# EAGLE design ce_hdd_scsi (EAGLE 6.2)
Assembly variants: ACSI, SCSI

## Sheet 1 of 4: IKBD part
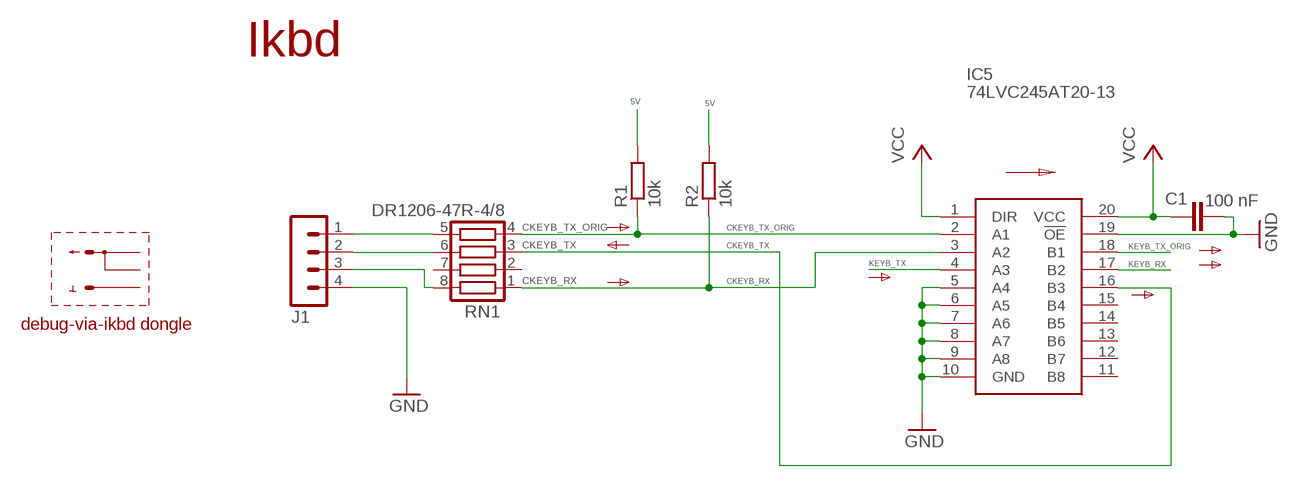
[diagram p0: schematic, sheet 1]

### Parts
C1  100 nF  C-EUC0603  [C0603]
IC5  74LVC245AT20-13  [SOP65P640X120-20N]
J1  MA04-1  [MA04-1]
R1  10k  R-EU_R0603  [R0603]
R2  10k  R-EU_R0603  [R0603]
RN1  DR1206-47R-4/8  CTS742C083  [CTS742C083]

### Nets
5V: R1.2 R2.2 ; also sheet 3,4
CKEYB_RX: IC5.3(A2) R2.1 RN1.1
CKEYB_TX: IC5.16(B3) RN1.3
CKEYB_TX_ORIG: IC5.2(A1) R1.1 RN1.4
GND: C1.1 IC5.5(A4) IC5.6(A5) IC5.7(A6) IC5.8(A7) IC5.9(A8) IC5.10(GND) IC5.19(!OE) J1.4 ; also sheet 2,3,4
KEYB_RX: IC5.17(B2) ; also sheet 4
KEYB_TX: IC5.4(A3) ; also sheet 4
KEYB_TX_ORIG: IC5.18(B1) ; also sheet 4
N$21: J1.2 RN1.6
VCC: C1.2 IC5.1(DIR) IC5.20(VCC) ; also sheet 2,4
ZKEYB_RX: J1.3 RN1.8
ZKEYB_TX_ORIG: J1.1 RN1.5
Unconnected: IC5.11(B8) IC5.12(B7) IC5.13(B6) IC5.14(B5) IC5.15(B4) RN1.2 RN1.7

### Notes on the sheet
- Ikbd
- debug-via-ikbd dongle

## Sheet 2 of 4: SCSI drivers and termination
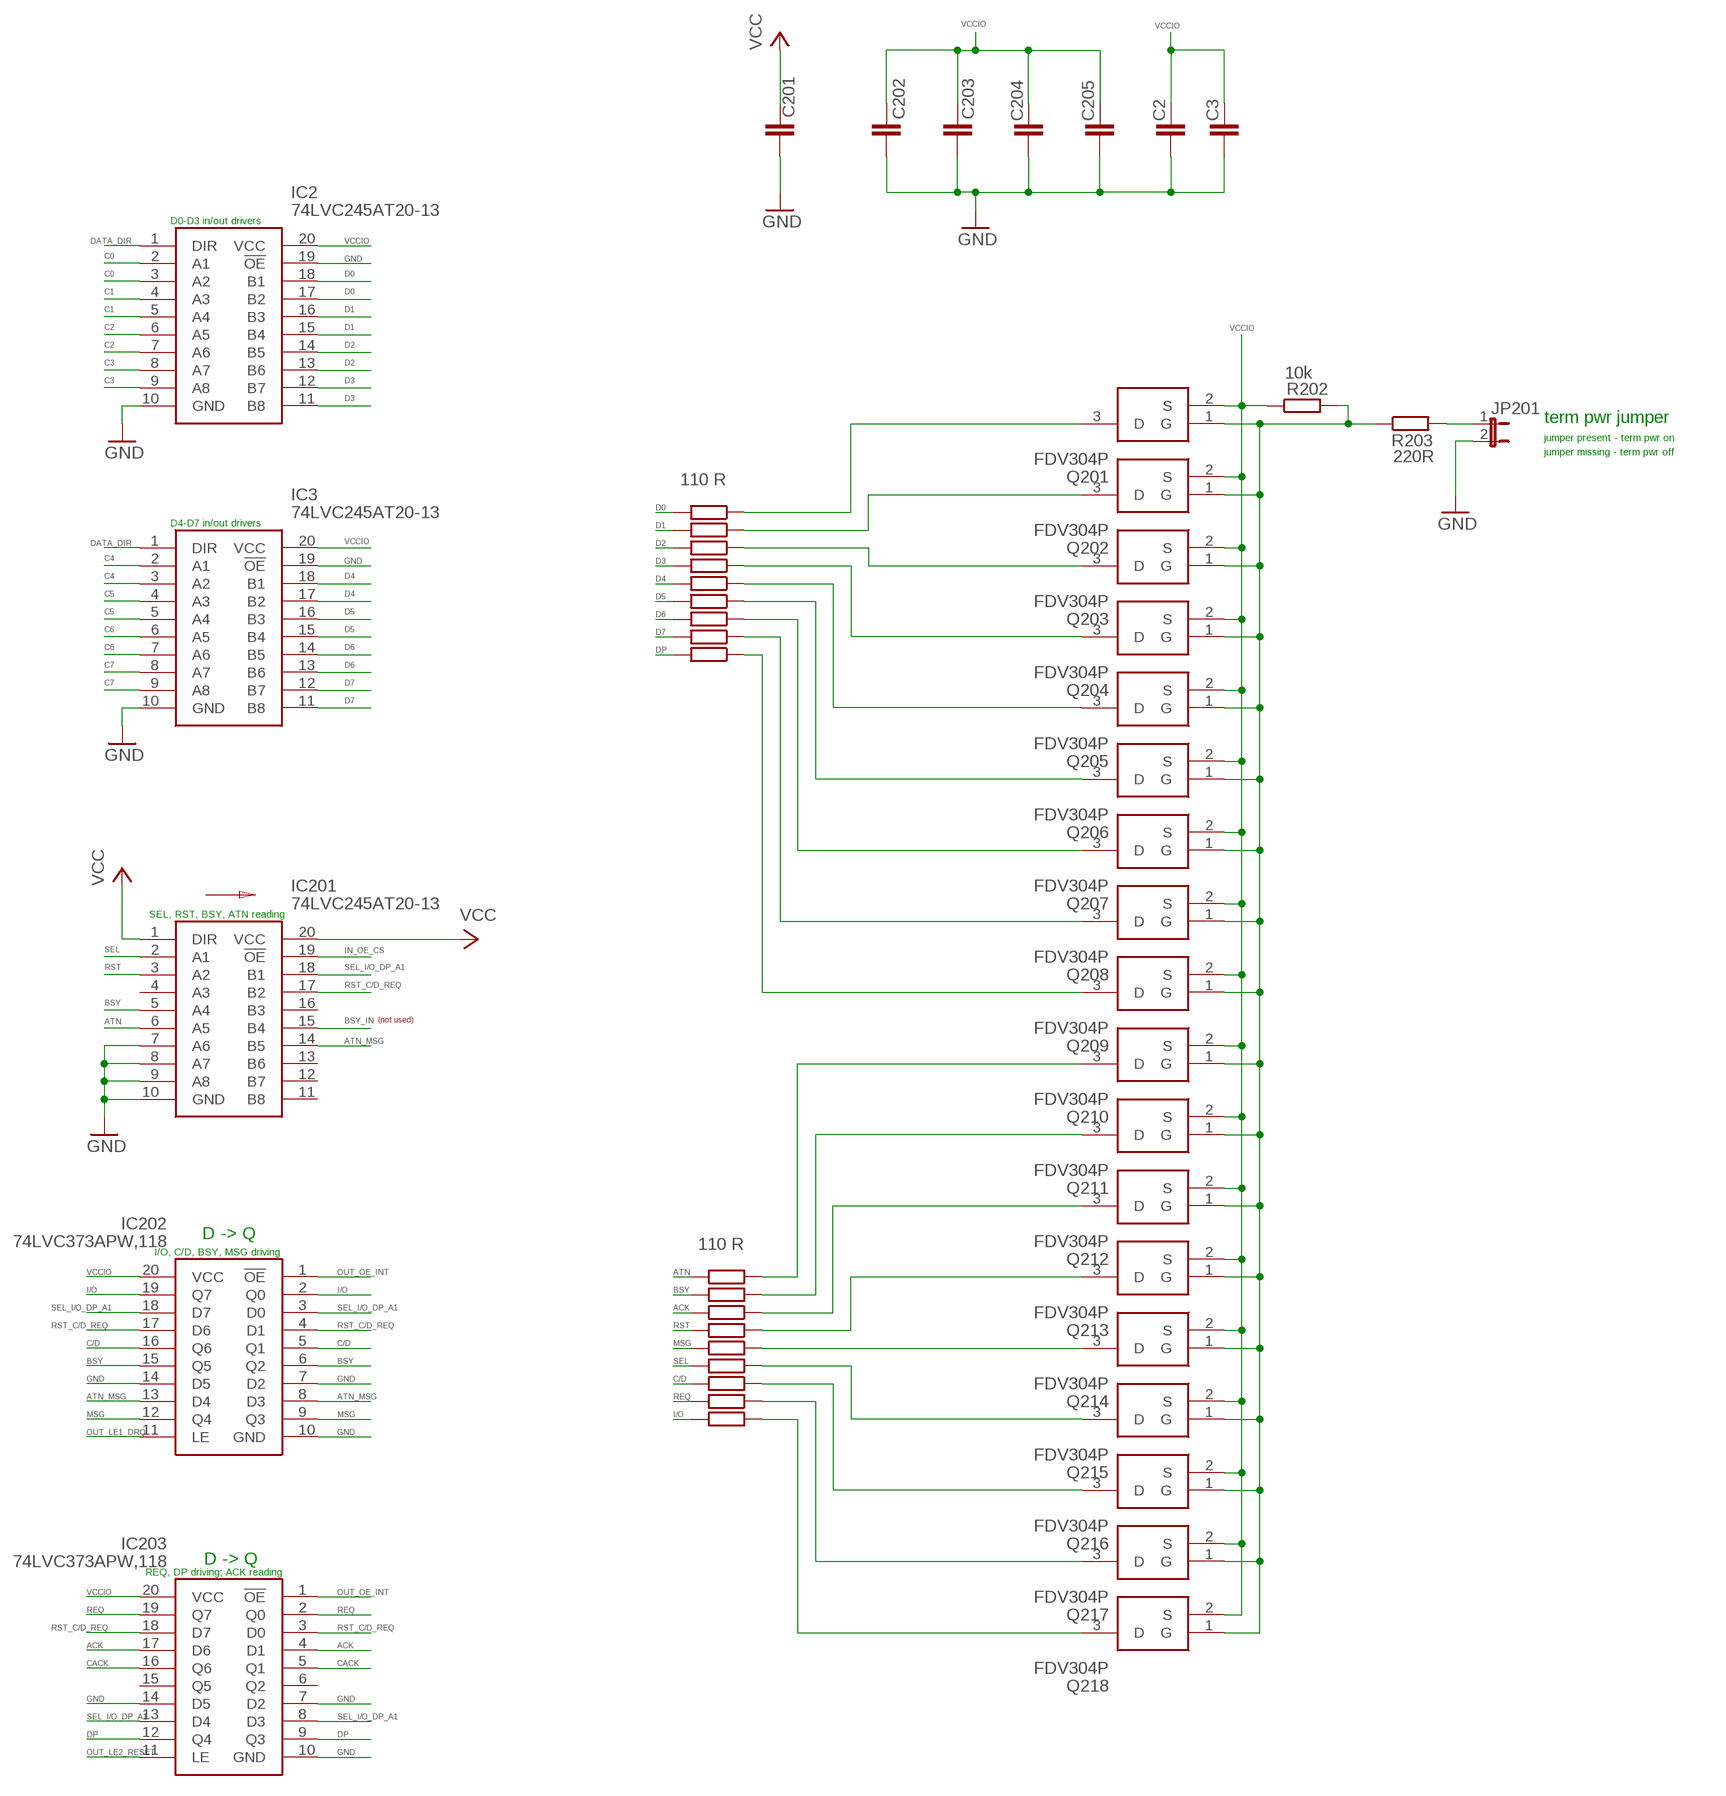
[diagram p1: schematic, sheet 2]

### Parts
C2  100 nF  C-EUC0603  [C0603]
C3  100 nF  C-EUC0603  [C0603]
C201  100 nF  C-EUC0603  [C0603]  (not fitted in variant ACSI)
C202  100 nF  C-EUC0603  [C0603]  (not fitted in variant ACSI)
C203  1 uF  C-EUC0603  [C0603]  (not fitted in variant ACSI)
C204  100 nF  C-EUC0603  [C0603]  (not fitted in variant ACSI)
C205  100 nF  C-EUC0603  [C0603]  (not fitted in variant ACSI)
IC2  74LVC245AT20-13  [SOP65P640X120-20N]
IC3  74LVC245AT20-13  [SOP65P640X120-20N]
IC201  74LVC245AT20-13  [SOP65P640X120-20N]  (not fitted in variant ACSI)
IC202  74LVC373APW,118  [SOP65P640X110-20N]  (not fitted in variant ACSI)
IC203  74LVC373APW,118  [SOP65P640X110-20N]  (not fitted in variant ACSI)
JP201  JP1E  [JP1]  (not fitted in variant ACSI)
Q201  FDV304P  IRLML6401TRPBF  [SOT95P237X112-3N]  (not fitted in variant ACSI)
Q202  FDV304P  IRLML6401TRPBF  [SOT95P237X112-3N]  (not fitted in variant ACSI)
Q203  FDV304P  IRLML6401TRPBF  [SOT95P237X112-3N]  (not fitted in variant ACSI)
Q204  FDV304P  IRLML6401TRPBF  [SOT95P237X112-3N]  (not fitted in variant ACSI)
Q205  FDV304P  IRLML6401TRPBF  [SOT95P237X112-3N]  (not fitted in variant ACSI)
Q206  FDV304P  IRLML6401TRPBF  [SOT95P237X112-3N]  (not fitted in variant ACSI)
Q207  FDV304P  IRLML6401TRPBF  [SOT95P237X112-3N]  (not fitted in variant ACSI)
Q208  FDV304P  IRLML6401TRPBF  [SOT95P237X112-3N]  (not fitted in variant ACSI)
Q209  FDV304P  IRLML6401TRPBF  [SOT95P237X112-3N]  (not fitted in variant ACSI)
Q210  FDV304P  IRLML6401TRPBF  [SOT95P237X112-3N]  (not fitted in variant ACSI)
Q211  FDV304P  IRLML6401TRPBF  [SOT95P237X112-3N]  (not fitted in variant ACSI)
Q212  FDV304P  IRLML6401TRPBF  [SOT95P237X112-3N]  (not fitted in variant ACSI)
Q213  FDV304P  IRLML6401TRPBF  [SOT95P237X112-3N]  (not fitted in variant ACSI)
Q214  FDV304P  IRLML6401TRPBF  [SOT95P237X112-3N]  (not fitted in variant ACSI)
Q215  FDV304P  IRLML6401TRPBF  [SOT95P237X112-3N]  (not fitted in variant ACSI)
Q216  FDV304P  IRLML6401TRPBF  [SOT95P237X112-3N]  (not fitted in variant ACSI)
Q217  FDV304P  IRLML6401TRPBF  [SOT95P237X112-3N]  (not fitted in variant ACSI)
Q218  FDV304P  IRLML6401TRPBF  [SOT95P237X112-3N]  (not fitted in variant ACSI)
R202  10k  R-EU_R0603  [R0603]  (not fitted in variant ACSI)
R203  220R  R-EU_R0603  [R0603]  (not fitted in variant ACSI)
R204  110 R  R-EU_R0603  [R0603]  (not fitted in variant ACSI)
R205  110 R  R-EU_R0603  [R0603]  (not fitted in variant ACSI)
R206  110 R  R-EU_R0603  [R0603]  (not fitted in variant ACSI)
R207  110 R  R-EU_R0603  [R0603]  (not fitted in variant ACSI)
R208  110 R  R-EU_R0603  [R0603]  (not fitted in variant ACSI)
R209  110 R  R-EU_R0603  [R0603]  (not fitted in variant ACSI)
R210  110 R  R-EU_R0603  [R0603]  (not fitted in variant ACSI)
R211  110 R  R-EU_R0603  [R0603]  (not fitted in variant ACSI)
R212  110 R  R-EU_R0603  [R0603]  (not fitted in variant ACSI)
R213  110 R  R-EU_R0603  [R0603]  (not fitted in variant ACSI)
R214  110 R  R-EU_R0603  [R0603]  (not fitted in variant ACSI)
R215  110 R  R-EU_R0603  [R0603]  (not fitted in variant ACSI)
R216  110 R  R-EU_R0603  [R0603]  (not fitted in variant ACSI)
R217  110 R  R-EU_R0603  [R0603]  (not fitted in variant ACSI)
R218  110 R  R-EU_R0603  [R0603]  (not fitted in variant ACSI)
R219  110 R  R-EU_R0603  [R0603]  (not fitted in variant ACSI)
R220  110 R  R-EU_R0603  [R0603]  (not fitted in variant ACSI)
R221  110 R  R-EU_R0603  [R0603]  (not fitted in variant ACSI)

### Nets
AAAA: Q201.3(D) R204.1
ACK: IC203.4(D1) IC203.17(D6) R215.2 ; also sheet 3
ATN: IC201.6(A5) R213.2 ; also sheet 3
ATN_MSG: IC201.14(B5) IC202.8(D3) IC202.13(D4) ; also sheet 4
BSY: IC201.5(A4) IC202.6(Q2) IC202.15(Q5) R214.2 ; also sheet 3
BSY_IN: IC201.15(B4)
C0: IC2.2(A1) IC2.3(A2) ; also sheet 4
C1: IC2.4(A3) IC2.5(A4) ; also sheet 4
C2: IC2.6(A5) IC2.7(A6) ; also sheet 4
C3: IC2.8(A7) IC2.9(A8) ; also sheet 4
C4: IC3.2(A1) IC3.3(A2) ; also sheet 4
C5: IC3.4(A3) IC3.5(A4) ; also sheet 4
C6: IC3.6(A5) IC3.7(A6) ; also sheet 4
C7: IC3.8(A7) IC3.9(A8) ; also sheet 4
C/D: IC202.5(Q1) IC202.16(Q6) R219.2 ; also sheet 3
CACK: IC203.5(Q1) IC203.16(Q6) ; also sheet 4
D0: IC2.17(B2) IC2.18(B1) R204.2 ; also sheet 3
D1: IC2.15(B4) IC2.16(B3) R205.2 ; also sheet 3
D2: IC2.13(B6) IC2.14(B5) R206.2 ; also sheet 3
D3: IC2.11(B8) IC2.12(B7) R207.2 ; also sheet 3
D4: IC3.17(B2) IC3.18(B1) R208.2 ; also sheet 3
D5: IC3.15(B4) IC3.16(B3) R209.2 ; also sheet 3
D6: IC3.13(B6) IC3.14(B5) R210.2 ; also sheet 3
D7: IC3.11(B8) IC3.12(B7) R211.2 ; also sheet 3
DATA_DIR: IC2.1(DIR) IC3.1(DIR) ; also sheet 4
DP: IC203.9(Q3) IC203.12(Q4) R212.2 ; also sheet 3
GND: C2.2 C3.2 C201.2 C202.2 C203.2 C204.2 C205.2 IC2.10(GND) IC2.19(!OE) IC3.10(GND) IC3.19(!OE) IC201.7(A6) IC201.8(A7) IC201.9(A8) IC201.10(GND) IC202.7(D2) IC202.10(GND) IC202.14(D5) IC203.7(D2) IC203.10(GND) IC203.14(D5) JP201.2 ; also sheet 1,3,4
I/O: IC202.2(Q0) IC202.19(Q7) R221.2 ; also sheet 3
IN_OE_CS: IC201.19(!OE) ; also sheet 4
MSG: IC202.9(Q3) IC202.12(Q4) R217.2 ; also sheet 3
N$8: JP201.1 R203.2
N$12: Q202.3(D) R205.1
N$13: Q203.3(D) R206.1
N$14: Q204.3(D) R207.1
N$15: Q205.3(D) R208.1
N$18: Q206.3(D) R209.1
N$19: Q207.3(D) R210.1
N$20: Q208.3(D) R211.1
N$22: Q209.3(D) R212.1
N$24: Q210.3(D) R213.1
N$100: Q211.3(D) R214.1
N$101: Q212.3(D) R215.1
N$102: Q213.3(D) R216.1
N$103: Q214.3(D) R217.1
N$104: Q215.3(D) R218.1
N$105: Q216.3(D) R219.1
N$106: Q217.3(D) R220.1
N$107: Q218.3(D) R221.1
OUT_LE1_DRQ: IC202.11(LE) ; also sheet 4
OUT_LE2_RESET: IC203.11(LE) ; also sheet 4
OUT_OE_INT: IC202.1(!OE) IC203.1(!OE) ; also sheet 4
REQ: IC203.2(Q0) IC203.19(Q7) R220.2 ; also sheet 3
RST: IC201.3(A2) R216.2 ; also sheet 3
RST_C/D_REQ: IC201.17(B2) IC202.4(D1) IC202.17(D6) IC203.3(D0) IC203.18(D7) ; also sheet 4
SEL: IC201.2(A1) R218.2 ; also sheet 3
SEL_I/O_DP_A1: IC201.18(B1) IC202.3(D0) IC202.18(D7) IC203.8(D3) IC203.13(D4) ; also sheet 4
TP_ON: Q201.1(G) Q202.1(G) Q203.1(G) Q204.1(G) Q205.1(G) Q206.1(G) Q207.1(G) Q208.1(G) Q209.1(G) Q210.1(G) Q211.1(G) Q212.1(G) Q213.1(G) Q214.1(G) Q215.1(G) Q216.1(G) Q217.1(G) Q218.1(G) R202.2 R203.1
VCC: C201.1 IC201.1(DIR) IC201.20(VCC) ; also sheet 1,4
VCCIO: C2.1 C3.1 C202.1 C203.1 C204.1 C205.1 IC2.20(VCC) IC3.20(VCC) IC202.20(VCC) IC203.20(VCC) Q201.2(S) Q202.2(S) Q203.2(S) Q204.2(S) Q205.2(S) Q206.2(S) Q207.2(S) Q208.2(S) Q209.2(S) Q210.2(S) Q211.2(S) Q212.2(S) Q213.2(S) Q214.2(S) Q215.2(S) Q216.2(S) Q217.2(S) Q218.2(S) R202.1 ; also sheet 3
Unconnected: IC201.4(A3) IC201.11(B8) IC201.12(B7) IC201.13(B6) IC201.16(B3) IC203.6(Q2) IC203.15(Q5)

### Notes on the sheet
- D0-D3 in/out drivers
- term pwr jumper
- jumper present - term pwr on
- jumper missing - term pwr off
- D4-D7 in/out drivers
- SEL, RST, BSY, ATN reading
- (not used)
- D -> Q
- I/O, C/D, BSY, MSG driving
- D -> Q
- REQ, DP driving; ACK reading

## Sheet 3 of 4: SCSI connectors
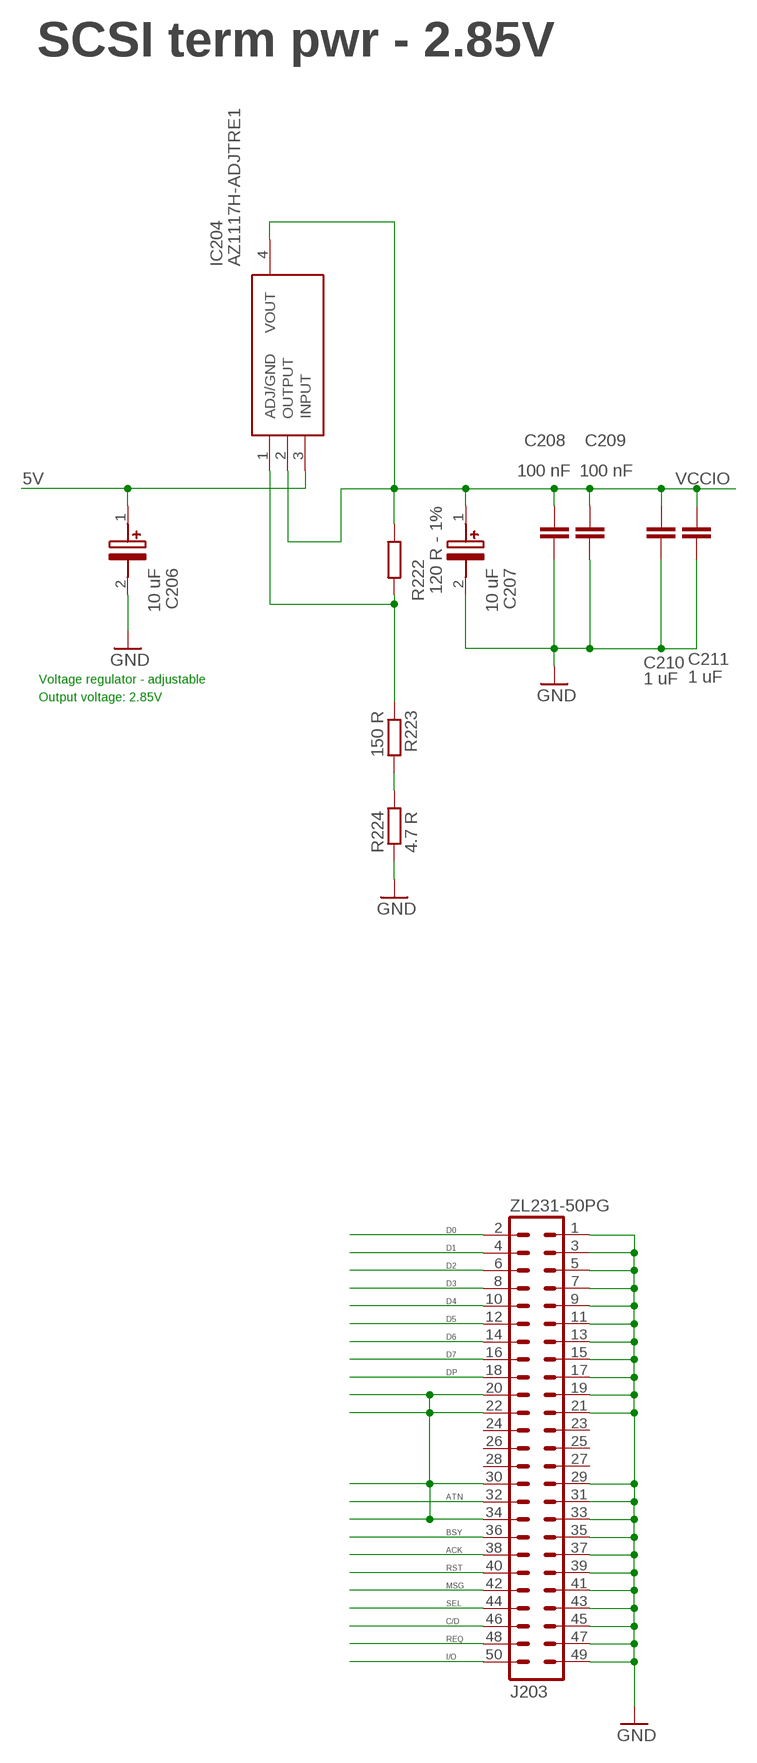
[diagram p2: schematic, sheet 3]

### Parts
C206  10 uF  293D106X9016B2TE3  [CAPPM3528X210N]  (not fitted in variant ACSI)
C207  10 uF  293D106X9016B2TE3  [CAPPM3528X210N]  (not fitted in variant ACSI)
C208  100 nF  C-EUC0603  [C0603]  (not fitted in variant ACSI)
C209  100 nF  C-EUC0603  [C0603]  (not fitted in variant ACSI)
C210  1 uF  C-EUC0603  [C0603]  (not fitted in variant ACSI)
C211  1 uF  C-EUC0603  [C0603]  (not fitted in variant ACSI)
IC204  AZ1117H-ADJTRE1  [SOT230P700X185-4N]  (not fitted in variant ACSI)
J203  ZL231-50PG  ML50  [ML50]  (not fitted in variant ACSI)
R222  120 R - 1%  R-EU_R0603  [R0603]  (not fitted in variant ACSI)
R223  150 R  R-EU_R0603  [R0603]  (not fitted in variant ACSI)
R224  4.7 R  R-EU_R0603  [R0603]  (not fitted in variant ACSI)

### Nets
5V: C206.1(+) IC204.3(INPUT) ; also sheet 1,4
ACK: J203.38 ; also sheet 2
ATN: J203.32 ; also sheet 2
BSY: J203.36 ; also sheet 2
C/D: J203.46 ; also sheet 2
D0: J203.2 ; also sheet 2
D1: J203.4 ; also sheet 2
D2: J203.6 ; also sheet 2
D3: J203.8 ; also sheet 2
D4: J203.10 ; also sheet 2
D5: J203.12 ; also sheet 2
D6: J203.14 ; also sheet 2
D7: J203.16 ; also sheet 2
DP: J203.18 ; also sheet 2
GND: C206.2(-) C207.2(-) C208.2 C209.2 C210.2 C211.2 J203.1 J203.3 J203.5 J203.7 J203.9 J203.11 J203.13 J203.15 J203.17 J203.19 J203.20 J203.21 J203.22 J203.29 J203.30 J203.31 J203.33 J203.34 J203.35 J203.37 J203.39 J203.41 J203.43 J203.45 J203.47 J203.49 R224.1 ; also sheet 1,2,4
I/O: J203.50 ; also sheet 2
MSG: J203.42 ; also sheet 2
N$5: R223.2 R224.2
N$30: IC204.1(ADJ/GND) R222.2 R223.1
REQ: J203.48 ; also sheet 2
RST: J203.40 ; also sheet 2
SEL: J203.44 ; also sheet 2
VCCIO: C207.1(+) C208.1 C209.1 C210.1 C211.1 IC204.2(OUTPUT) IC204.4(VOUT) R222.1 ; also sheet 2
Unconnected: J203.23 J203.24 J203.25 J203.26 J203.27 J203.28

### Notes on the sheet
- SCSI term pwr - 2.85V
- Voltage regulator - adjustable
- Output voltage: 2.85V

## Sheet 4 of 4: PICO, power, LEDs
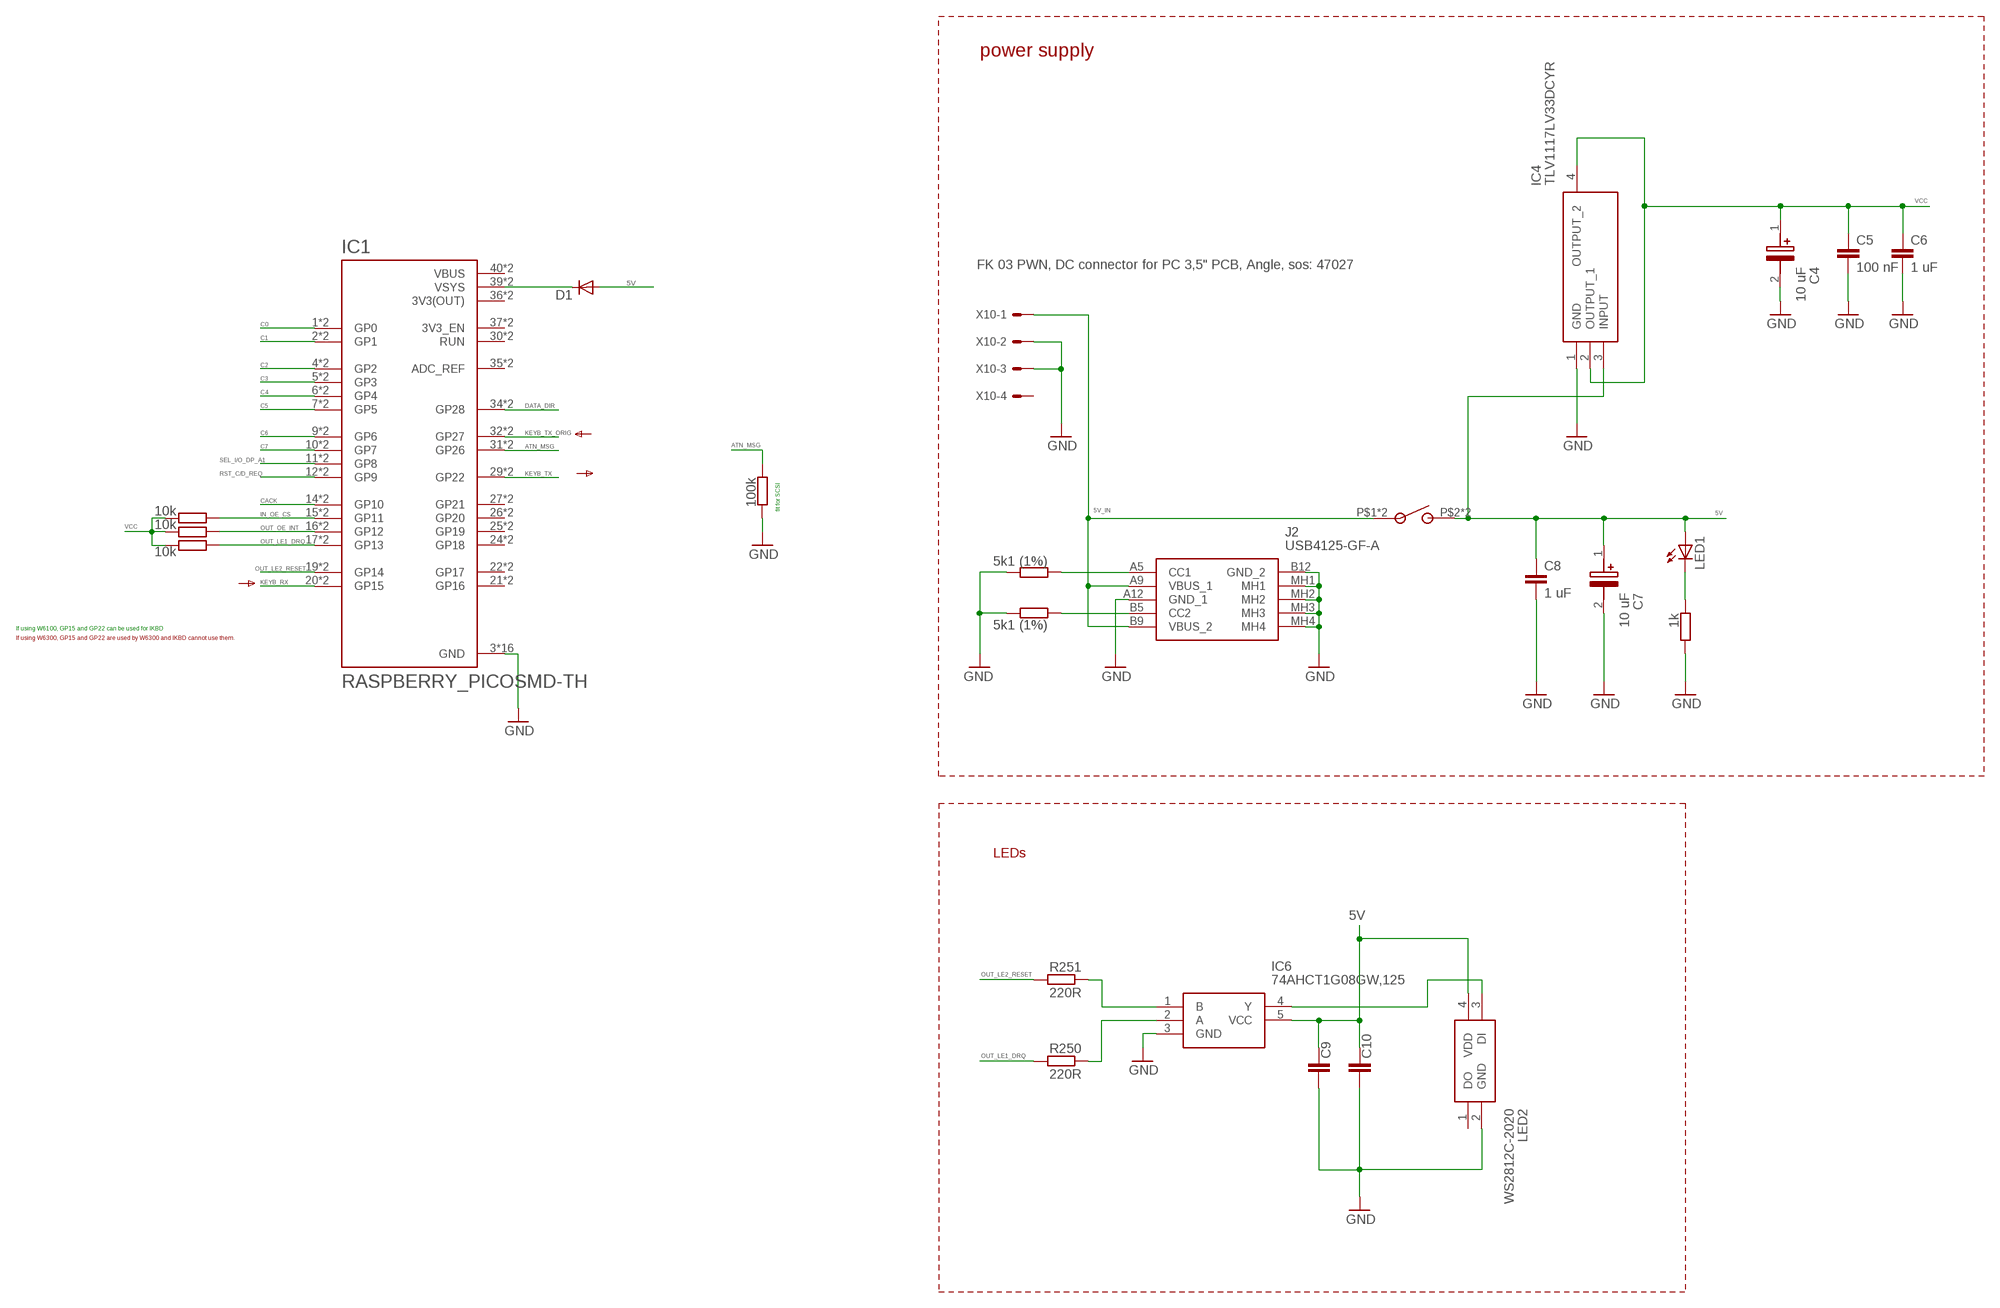
[diagram p3: schematic, sheet 4]

### Parts
C4  10 uF  293D106X9016B2TE3  [CAPPM3528X210N]
C5  100 nF  C-EUC0603  [C0603]
C6  1 uF  C-EUC0603  [C0603]
C7  10 uF  293D106X9016B2TE3  [CAPPM3528X210N]
C8  1 uF  C-EUC0603  [C0603]
C9  100 nF  C-EUC0603  [C0603]
C10  100 nF  C-EUC0603  [C0603]
D1  SK110-DIO  DIODE-DO214AC  [DO214AC]
IC1  RASPBERRY_PICOSMD-TH  [PICO-PKG]
IC4  TLV1117LV33DCYR  [SOT230P700X180-4N]
IC6  74AHCT1G08GW,125  [SOT65P212X110-5N]
J2  USB4125-GF-A  [USB4125GFA]
LED1  LEDSML0603  [SML0603]
LED2  WS2812C-2020  [WS2812C2020]
R3  5k1 (1%)  R-EU_R0603  [R0603]
R4  5k1 (1%)  R-EU_R0603  [R0603]
R5  1k  R-EU_R0603  [R0603]
R6  10k  R-EU_R0603  [R0603]
R7  10k  R-EU_R0603  [R0603]
R8  10k  R-EU_R0603  [R0603]
R225  100k  R-EU_R0603  [R0603]  (not fitted in variant ACSI)
R250  220R  R-EU_R0603  [R0603]  (not fitted in variant ACSI)
R251  220R  R-EU_R0603  [R0603]  (not fitted in variant ACSI)
SW1  SMSR-1  [SMRS-1]
X10  FK 03 PWN, DC connector for PC 3,5" PCB, Angle, sos: 47027  22-05-7048-04  [7395-04]

### Nets
5V: C7.1(+) C8.1 C9.1 C10.1 D1.A IC4.3(INPUT) IC6.5(VCC) LED1.A LED2.4(VDD) SW1.P$2 SW1.P$3 ; also sheet 1,3
5V_IN: J2.A9(VBUS_1) J2.B9(VBUS_2) SW1.P$1 SW1.P$4 X10.1
ATN_MSG: IC1.31(GP26) IC1.P$31(GP26) R225.1 ; also sheet 2
C0: IC1.1(GP0) IC1.P$1(GP0) ; also sheet 2
C1: IC1.2(GP1) IC1.P$2(GP1) ; also sheet 2
C2: IC1.4(GP2) IC1.P$4(GP2) ; also sheet 2
C3: IC1.5(GP3) IC1.P$5(GP3) ; also sheet 2
C4: IC1.6(GP4) IC1.P$6(GP4) ; also sheet 2
C5: IC1.7(GP5) IC1.P$7(GP5) ; also sheet 2
C6: IC1.9(GP6) IC1.P$9(GP6) ; also sheet 2
C7: IC1.10(GP7) IC1.P$10(GP7) ; also sheet 2
CACK: IC1.14(GP10) IC1.P$14(GP10) ; also sheet 2
DATA_DIR: IC1.34(GP28) IC1.P$34(GP28) ; also sheet 2
GND: C4.2(-) C5.2 C6.2 C7.2(-) C8.2 C9.2 C10.2 IC1.3(GND) IC1.8(GND) IC1.13(GND) IC1.18(GND) IC1.23(GND) IC1.28(GND) IC1.33(GND) IC1.38(GND) IC1.P$3(GND) IC1.P$8(GND) IC1.P$13(GND) IC1.P$18(GND) IC1.P$23(GND) IC1.P$28(GND) IC1.P$33(GND) IC1.P$38(GND) IC4.1(GND) IC6.3(GND) J2.A12(GND_1) J2.B12(GND_2) J2.MH1 J2.MH2 J2.MH3 J2.MH4 LED2.2(GND) R3.2 R4.2 R5.2 R225.2 X10.2 X10.3 ; also sheet 1,2,3
IN_OE_CS: IC1.15(GP11) IC1.P$15(GP11) R6.2 ; also sheet 2
KEYB_RX: IC1.20(GP15) IC1.P$20(GP15) ; also sheet 1
KEYB_TX: IC1.29(GP22) IC1.P$29(GP22) ; also sheet 1
KEYB_TX_ORIG: IC1.32(GP27) IC1.P$32(GP27) ; also sheet 1
N$1: J2.B5(CC2) R4.1
N$2: J2.A5(CC1) R3.1
N$3: IC6.2(A) R250.1
N$4: IC6.1(B) R251.1
N$6: LED1.C R5.1
N$7: IC6.4(Y) LED2.3(DI)
N$26: D1.C IC1.39(VSYS) IC1.P$39(VSYS)
OUT_LE1_DRQ: IC1.17(GP13) IC1.P$17(GP13) R8.2 R250.2 ; also sheet 2
OUT_LE2_RESET: IC1.19(GP14) IC1.P$19(GP14) R251.2 ; also sheet 2
OUT_OE_INT: IC1.16(GP12) IC1.P$16(GP12) R7.2 ; also sheet 2
RST_C/D_REQ: IC1.12(GP9) IC1.P$12(GP9) ; also sheet 2
SEL_I/O_DP_A1: IC1.11(GP8) IC1.P$11(GP8) ; also sheet 2
VCC: C4.1(+) C5.1 C6.1 IC4.2(OUTPUT_1) IC4.4(OUTPUT_2) R6.1 R7.1 R8.1 ; also sheet 1,2
Unconnected: IC1.21(GP16) IC1.22(GP17) IC1.24(GP18) IC1.25(GP19) IC1.26(GP20) IC1.27(GP21) IC1.30(RUN) IC1.35(ADC_REF) IC1.37(3V3_EN) IC1.P$21(GP16) IC1.P$22(GP17) IC1.P$24(GP18) IC1.P$25(GP19) IC1.P$26(GP20) IC1.P$27(GP21) IC1.P$30(RUN) IC1.P$35(ADC_REF) IC1.P$37(3V3_EN) LED2.1(DO) X10.4

### Notes on the sheet
- power supply
- fit for SCSI
- If using W6100, GP15 and GP22 can be used for IKBD
- If using W6300, GP15 and GP22 are used by W6300 and IKBD cannot use them.
- LEDs

## Power pins joined to a net without a drawn wire
3V3(OUT): IC1.36(3V3(OUT)) IC1.P$36(3V3(OUT))
VBUS: IC1.40(VBUS) IC1.P$40(VBUS)

## Library data of the parts
C1-C3 C5 C6 C8-C10 C201-C205 C208-C211 = rcl:C-EU: CAPACITOR, European symbol
C4 C7 C206 C207 = 293D106X9016B2TE3:293D106X9016B2TE3: Solid Tantalum Surface Mount Chip Capacitors TANTAMOUNT(TM), Molded Case, Standard Industrial Grade Source: Datasheet <http://www.vishay.com/docs/40002/293d.pdf>; DESCRIPTION: Solid Tantalum Surface Mount Chip Capacitors TANTAMOUNT(TM), Molded Case, Standard Industrial Grade; HEIGHT: 2.1mm; MANUFACTURER_NAME: Vishay; MANUFACTURER_PART_NUMBER: 293D106X9016B2TE3
D1 = diode:DIODE-: DIODE
IC1 = RpiPico:RASPBERRY_PICO: Raspberry Pi Pico
IC2 IC3 IC5 IC201 = 74LVC245AT20-13:74LVC245AT20-13: Bus Transceivers Octal Buffer Trans 3-State Outputs Source: Datasheet <https://www.diodes.com/assets/Datasheets/74LVC245A.pdf>; DESCRIPTION: Bus Transceivers Octal Buffer Trans 3-State Outputs; HEIGHT: 1.2mm; MANUFACTURER_NAME: Diodes Incorporated; MANUFACTURER_PART_NUMBER: 74LVC245AT20-13
IC4 = TLV1117LV33DCYR:TLV1117LV33DCYR: 1-A, Positive Fixed Voltage, Low-Dropout Regulator Source: Datasheet <http://www.ti.com/lit/gpn/tlv1117lv>; DESCRIPTION: 1-A, Positive Fixed Voltage, Low-Dropout Regulator; HEIGHT: 1.8mm; MANUFACTURER_NAME: Texas Instruments; MANUFACTURER_PART_NUMBER: TLV1117LV33DCYR
IC6 = 74AHCT1G08GW_125:74AHCT1G08GW,125: 74AHC(T)1G08 - 2-input AND gate@en-us Source: Datasheet <https://assets.nexperia.com/documents/data-sheet/74AHC_AHCT1G08.pdf>; DESCRIPTION: 74AHC(T)1G08 - 2-input AND gate@en-us; HEIGHT: 1.1mm; MANUFACTURER_NAME: Nexperia; MANUFACTURER_PART_NUMBER: 74AHCT1G08GW,125
IC202 IC203 = 74LVC373APW_118:74LVC373APW,118: 74LVC373A - Octal D-type transparent latch with 5 V tolerant inputs/outputs; 3-State@en-us Source: Datasheet <https://assets.nexperia.com/documents/data-sheet/74LVC373A.pdf>; DESCRIPTION: 74LVC373A - Octal D-type transparent latch with 5 V tolerant inputs/outputs; 3-State@en-us; HEIGHT: 1.1mm; MANUFACTURER_NAME: Nexperia; MANUFACTURER_PART_NUMBER: 74LVC373APW,118
IC204 = AZ1117H-ADJTRE1:AZ1117H-ADJTRE1: DiodesZetex AZ1117H-ADJTRE1, LDO Voltage Regulator, Adjustable 1A, 1.25 12 V 2%, 3+Tab-Pin SOT-223 Source: Datasheet <https://www.diodes.com//assets/Datasheets/products_inactive_data/AZ1117.pdf>; DESCRIPTION: DiodesZetex AZ1117H-ADJTRE1, LDO Voltage Regulator, Adjustable 1A, 1.25 12 V 2%, 3+Tab-Pin SOT-223; HEIGHT: 1.85mm; MANUFACTURER_NAME: Diodes Incorporated; MANUFACTURER_PART_NUMBER: AZ1117H-ADJTRE1
J1 = con-lstb:MA04-1: PIN HEADER; OC_FARNELL: unknown; OC_NEWARK: unknown
J2 = USB4125-GF-A:USB4125-GF-A: USB-C (USB TYPE-C) Receptacle Connector 24 (6+18 Dummy) Position Surface Mount, Right Angle; Through Hole Source: Datasheet <https://gct.co/files/drawings/usb4125.pdf?v=f2858e04-a173-4b74-b17f-8f865ddc3728>; DESCRIPTION: USB-C (USB TYPE-C) Receptacle Connector 24 (6+18 Dummy) Position Surface Mount, Right Angle; Through Hole; HEIGHT: 3.41mm; MANUFACTURER_NAME: GCT (GLOBAL CONNECTOR TECHNOLOGY); MANUFACTURER_PART_NUMBER: USB4125-GF-A
J203 = con-harting-ml:ML50: HARTING; OC_FARNELL: unknown; OC_NEWARK: unknown
JP201 = jumper:JP1E: JUMPER
LED1 = led:LED: LED OSRAM: - CHIPLED LG R971, LG N971, LY N971, LG Q971, LY Q971, LO R971, LY R971 LH N974, LH R974 LS Q976, LO Q976, LY Q976 LO Q996 - Hyper CHIPLED LW Q18S LB Q993, LB Q99A, LB R99A - SideLED LS A670, LO A670, LY A670, LG A670, LP A670 LB A673, LV A673, LT A673, LW A673 LH A674 LY A675 LS A676, LA A676, LO A676, LY A676, LW A676 LS A679, LY A679, LG A679 - Hyper Micro SIDELED® LS Y876, LA Y876, LO Y876, LY Y876 LT Y87S - SmartLED LW L88C, LW L88S LB L89C, LB L89S, LG L890 LS L89K, LO L89K, LY L89K LS L896, LA L896, LO L896, LY L896 - TOPLED LS T670, LO T670, LY T670, LG T670, LP T670 LSG T670, LSP T670, LSY T670, LOP T670, LYG T670 LG T671, LOG T671, LSG T671 LB T673, LV T673, LT T673, LW T673 LH T674 LS T676, LA T676, LO T676, LY T676, LB T676, LH T676, LSB T676, LW T676 LB T67C, LV T67C, LT T67C, LS T67K, LO T67K, LY T67K, LW E67C LS E67B, LA E67B, LO E67B, LY E67B, LB E67C, LV E67C, LT E67C LW T67C LS T679, LY T679, LG T679 LS T770, LO T770, LY T770, LG T770, LP T770 LB T773, LV T773, LT T773, LW T773 LH T774 LS E675, LA E675, LY E675, LS T675 LS T776, LA T776, LO T776, LY T776, LB T776 LHGB T686 LT T68C, LB T68C - Hyper Mini TOPLED® LB M676 - Mini TOPLED Santana® LG M470 LS M47K, LO M47K, LY M47K Source: http://www.osram.convergy.de LUXEON: - LUMILED® LXK2-PW12-R00, LXK2-PW12-S00, LXK2-PW14-U00, LXK2-PW14-V00 LXK2-PM12-R00, LXK2-PM12-S00, LXK2-PM14-U00 LXK2-PE12-Q00, LXK2-PE12-R00, LXK2-PE12-S00, LXK2-PE14-T00, LXK2-PE14-U00 LXK2-PB12-K00, LXK2-PB12-L00, LXK2-PB12-M00, LXK2-PB14-N00, LXK2-PB14-P00, LXK2-PB14-Q00 LXK2-PR12-L00, LXK2-PR12-M00, LXK2-PR14-Q00, LXK2-PR14-R00 LXK2-PD12-Q00, LXK2-PD12-R00, LXK2-PD12-S00 LXK2-PH12-R00, LXK2-PH12-S00 LXK2-PL12-P00, LXK2-PL12-Q00, LXK2-PL12-R00 Source: www.luxeon.com KINGBRIGHT: KA-3528ASYC Source: www.kingbright.com
LED2 = WS2812C-2020:WS2812C-2020: Intelligent control LED integrated light source Source: Datasheet <http://www.world-semi.com/DownLoadFile/139>; DESCRIPTION: Intelligent control LED integrated light source; HEIGHT: 0.84mm; MANUFACTURER_NAME: Worldsemi; MANUFACTURER_PART_NUMBER: WS2812C-2020
Q201-Q218 = IRLML6401TRPBF:IRLML6401TRPBF: INFINEON - IRLML6401TRPBF - MOSFET, P, MICRO3 Source: Datasheet <https://www.infineon.com/dgdl/irlml6401pbf.pdf?fileId=5546d462533600a401535668b96d2634>; DESCRIPTION: INFINEON - IRLML6401TRPBF - MOSFET, P, MICRO3; HEIGHT: 1.12mm; MANUFACTURER_NAME: Infineon; MANUFACTURER_PART_NUMBER: IRLML6401TRPBF
R1-R8 R202-R225 R250 R251 = rcl:R-EU_: RESISTOR, European symbol
RN1 = resistor-net:CTS742C083: Chip Resistor Array 4 Single Resistor Source: http://www.ctscorp.com/components/Datasheets/CTSChipArrayDs.pdf; OC_FARNELL: unknown; OC_NEWARK: unknown
SW1 = ce_fdd_v40:SMSR-1
X10 = con-molex:22-?-04: CONNECTOR wire to board 2.54 mm (.1 inch) pitch header; OC_FARNELL: unknown; OC_NEWARK: unknown

## Board
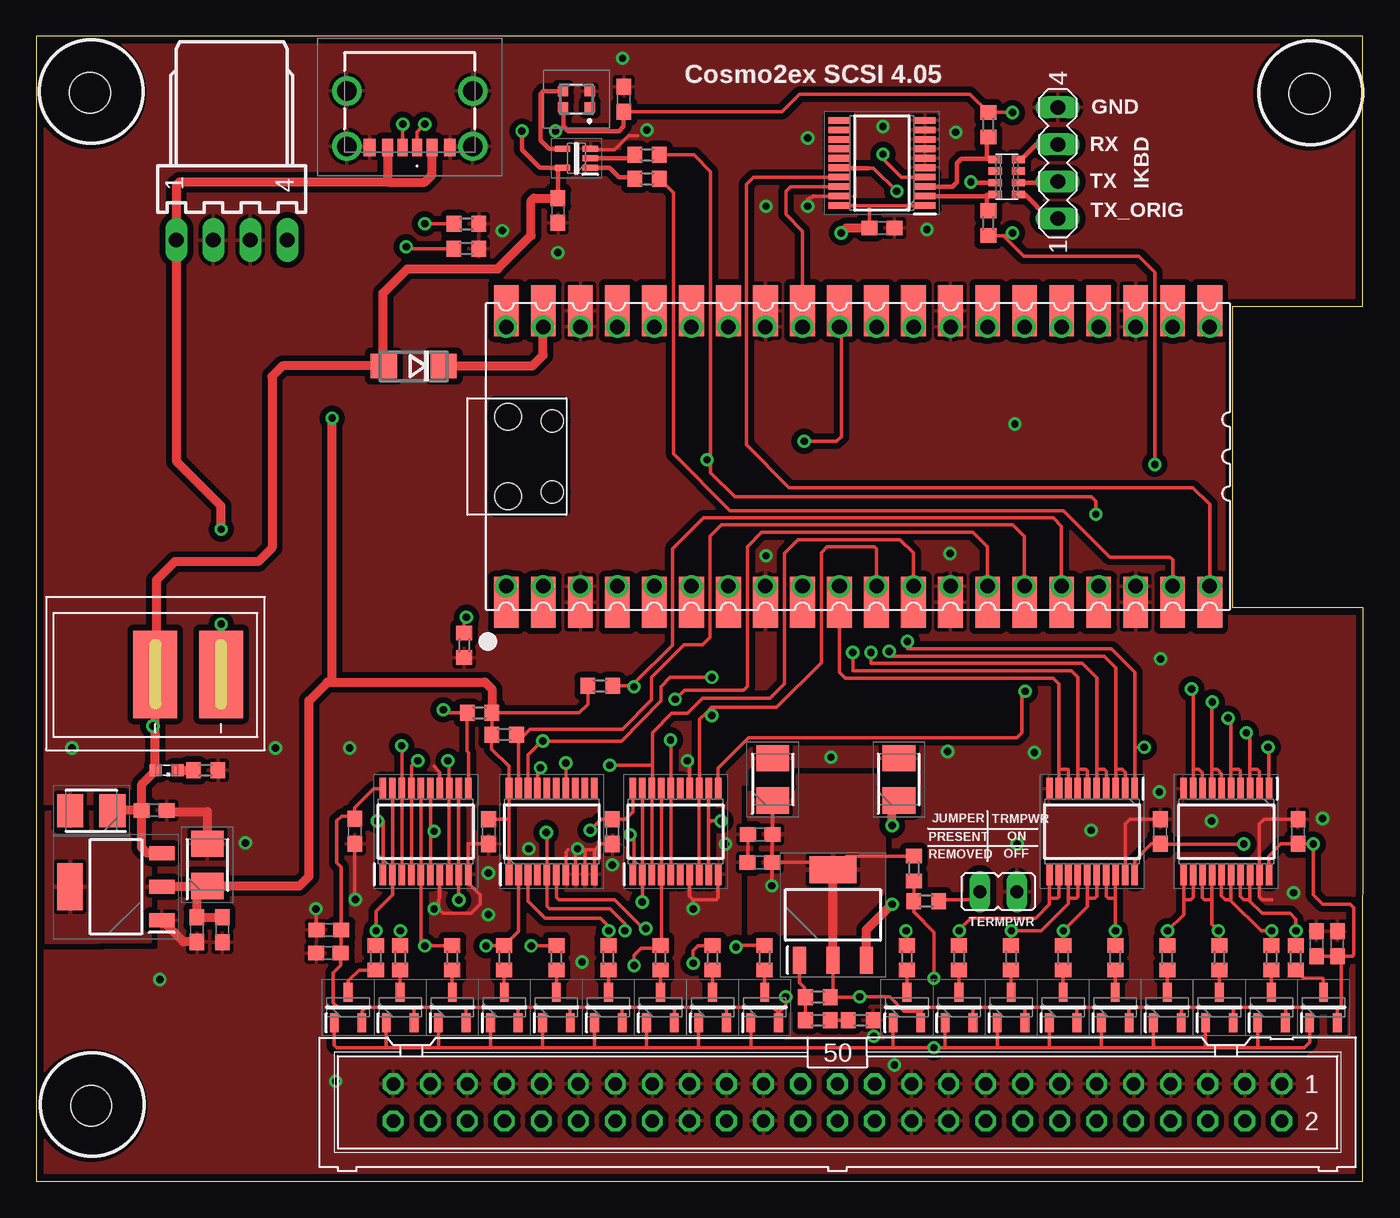
[diagram p4: board, top side]
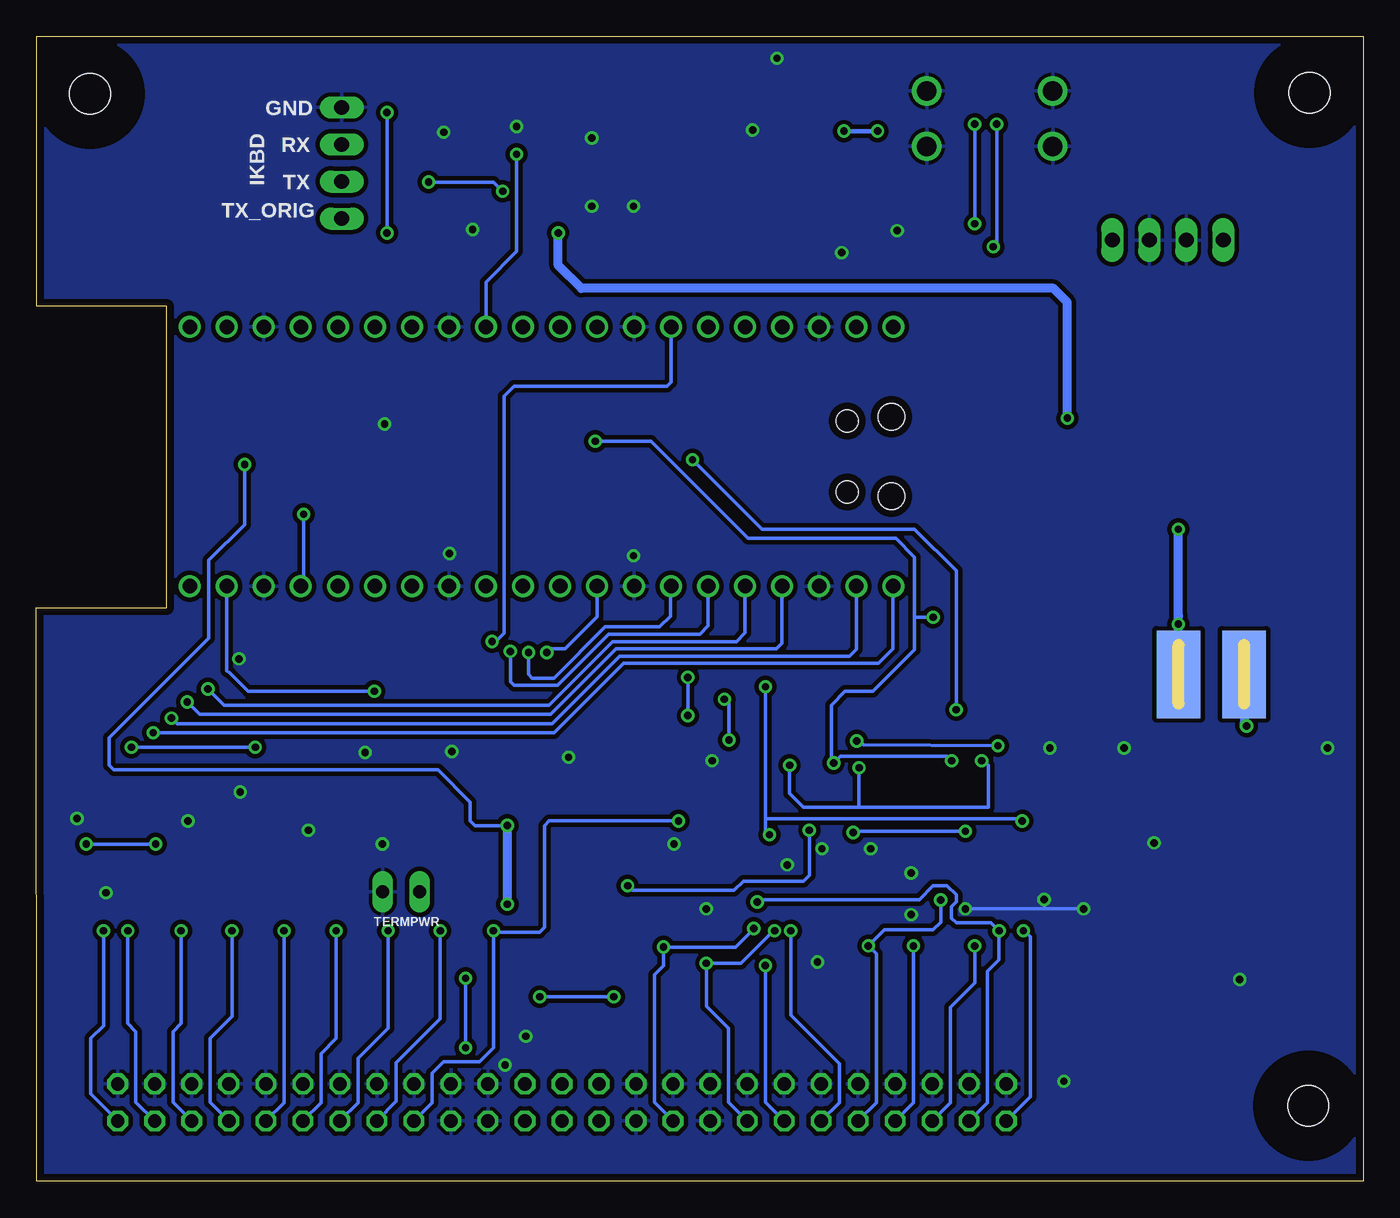
[diagram p5: board, bottom side, seen from below]

Size 91.01 x 78.5 mm. Coordinates in mm from the lower left corner, seen from the top.
Outline: 0,0 91,0 91.01,39.31 82.07,39.31 82.07,60 91,60 91,78.5 0,78.5 0,0
Copper layers (1*16): Top 0.035mm / dielectric 1.5mm / Bottom 0.035mm
Design rules: minimum track width 0.2mm, minimum drill 0.4mm, track to track 0.2mm, track to pad 0.2mm, pad to pad 0.2mm, via to via 0.2mm, smd to smd 0mil, copper to edge 0.5mm, drill to drill 0.5mm, minimum pad ring 10mil, minimum via ring 8mil, stop-mask expansion 4mil, vias tented up to drill 0mil, thermal gap 10mil
Holes 2.8 mm at 87.34,74.56 3.75,5.17 3.68,74.64
tKeepout: area 83.9,71.1 to 90.8,78; area 0.3,1.7 to 7.2,8.6; area 0.2,71.2 to 7.1,78.1
bKeepout: area 83.9,71.1 to 90.8,78; area 0.3,1.7 to 7.2,8.6; area 0.2,71.2 to 7.1,78.1
tRestrict: area 83.9,71.1 to 90.8,78; area 0.3,1.7 to 7.2,8.6; area 0.2,71.2 to 7.1,78.1; area 58.1,27.1 to 60.3,28; area 49.2,27.1 to 51.7,28
bRestrict: area 83.9,71.1 to 90.8,78; area 0.3,1.7 to 7.2,8.6; area 0.2,71.2 to 7.1,78.1

### Footprints (pad centres in the part's own frame; a part is rotated, then mirrored left to right if it is on the bottom)
C0603 = smd 1.1 x 1: 1 -0.85,0; 2 0.85,0
CAPPM3528X210N = smd 1.8 x 2.25: 1 -1.45,0; 2 1.45,0
DO214AC = smd 1.8 x 1.7: A 2.05,0; C -2.05,0
PICO-PKG = drill 1: 1 -8.89,24.13; 2 -8.89,21.59; 3 -8.89,19.05; 4 -8.89,16.51; 5 -8.89,13.97; 6 -8.89,11.43; 7 -8.89,8.89; 8 -8.89,6.35; 9 -8.89,3.81; 10 -8.89,1.27; 11 -8.89,-1.27; 12 -8.89,-3.81; 13 -8.89,-6.35; 14 -8.89,-8.89; 15 -8.89,-11.43; 16 -8.89,-13.97; 17 -8.89,-16.51; 18 -8.89,-19.05; 19 -8.89,-21.59; 20 -8.89,-24.13; 21 8.89,-24.13; 22 8.89,-21.59; 23 8.89,-19.05; 24 8.89,-16.51; 25 8.89,-13.97; 26 8.89,-11.43; 27 8.89,-8.89; 28 8.89,-6.35; 29 8.89,-3.81; 30 8.89,-1.27; 31 8.89,1.27; 32 8.89,3.81; 33 8.89,6.35; 34 8.89,8.89; 35 8.89,11.43; 36 8.89,13.97; 37 8.89,16.51; 38 8.89,19.05; 39 8.89,21.59; 40 8.89,24.13 | smd 3.5 x 1.7: P$1 -10,24.13; P$2 -10,21.59; P$3 -10,19.05; P$4 -10,16.51; P$5 -10,13.97; P$6 -10,11.43; P$7 -10,8.89; P$8 -10,6.35; P$9 -10,3.81; P$10 -10,1.27; P$11 -10,-1.27; P$12 -10,-3.81; P$13 -10,-6.35; P$14 -10,-8.89; P$15 -10,-11.43; P$16 -10,-13.97; P$17 -10,-16.51; P$18 -10,-19.05; P$19 -10,-21.59; P$20 -10,-24.13; P$21 10,-24.13; P$22 10,-21.59; P$23 10,-19.05; P$24 10,-16.51; P$25 10,-13.97; P$26 10,-11.43; P$27 10,-8.89; P$28 10,-6.35; P$29 10,-3.81; P$30 10,-1.27; P$31 10,1.27; P$32 10,3.81; P$33 10,6.35; P$34 10,8.89; P$35 10,11.43; P$36 10,13.97; P$37 10,16.51; P$38 10,19.05; P$39 10,21.59; P$40 10,24.13 | hole 1.8: -2.725,24; 2.725,24 | hole 1.5: -2.425,20.97; 2.425,20.97
SOP65P640X120-20N = smd 1.475 x 0.45: 1 -2.938,2.925; 2 -2.938,2.275; 3 -2.938,1.625; 4 -2.938,0.975; 5 -2.938,0.325; 6 -2.938,-0.325; 7 -2.938,-0.975; 8 -2.938,-1.625; 9 -2.938,-2.275; 10 -2.938,-2.925; 11 2.938,-2.925; 12 2.938,-2.275; 13 2.938,-1.625; 14 2.938,-0.975; 15 2.938,-0.325; 16 2.938,0.325; 17 2.938,0.975; 18 2.938,1.625; 19 2.938,2.275; 20 2.938,2.925
SOT230P700X180-4N = smd 1.75 x 0.95: 1 -3.15,2.3; 2 -3.15,0; 3 -3.15,-2.3 | smd 1.75 x 3.2: 4 3.15,0
SOT65P212X110-5N = smd 1.05 x 0.4: 1 -0.95,0.65; 2 -0.95,0; 3 -0.95,-0.65; 4 0.95,-0.65; 5 0.95,0.65
SOP65P640X110-20N = smd 1.475 x 0.45: 1 -2.938,2.925; 2 -2.938,2.275; 3 -2.938,1.625; 4 -2.938,0.975; 5 -2.938,0.325; 6 -2.938,-0.325; 7 -2.938,-0.975; 8 -2.938,-1.625; 9 -2.938,-2.275; 10 -2.938,-2.925; 11 2.938,-2.925; 12 2.938,-2.275; 13 2.938,-1.625; 14 2.938,-0.975; 15 2.938,-0.325; 16 2.938,0.325; 17 2.938,0.975; 18 2.938,1.625; 19 2.938,2.275; 20 2.938,2.925
SOT230P700X185-4N = smd 1.85 x 0.9: 1 -3.1,2.3; 2 -3.1,0; 3 -3.1,-2.3 | smd 1.85 x 3.2: 4 3.1,0
MA04-1 = drill 1.016 long: 1 -3.81,0; 2 -1.27,0; 3 1.27,0; 4 3.81,0
USB4125GFA = smd 0.7 x 1.2: A5 -0.5,2.778; B5 0.5,2.778 | smd 0.76 x 1.2: A9 1.52,2.778; B9 -1.52,2.778 | smd 0.8 x 1.2: A12 2.75,2.778; B12 -2.75,2.778 | drill 1.34 pad 2.01: MH1 4.32,2.698; MH2 4.32,-1.102; MH3 -4.32,-1.102; MH4 -4.32,2.698
ML50 = drill 0.914 octagon: 1 -30.48,-1.27; 2 -30.48,1.27; 3 -27.94,-1.27; 4 -27.94,1.27; 5 -25.4,-1.27; 6 -25.4,1.27; 7 -22.86,-1.27; 8 -22.86,1.27; 9 -20.32,-1.27; 10 -20.32,1.27; 11 -17.78,-1.27; 12 -17.78,1.27; 13 -15.24,-1.27; 14 -15.24,1.27; 15 -12.7,-1.27; 16 -12.7,1.27; 17 -10.16,-1.27; 18 -10.16,1.27; 19 -7.62,-1.27; 20 -7.62,1.27; 21 -5.08,-1.27; 22 -5.08,1.27; 23 -2.54,-1.27; 24 -2.54,1.27; 25 0,-1.27; 26 0,1.27; 27 2.54,-1.27; 28 2.54,1.27; 29 5.08,-1.27; 30 5.08,1.27; 31 7.62,-1.27; 32 7.62,1.27; 33 10.16,-1.27; 34 10.16,1.27; 35 12.7,-1.27; 36 12.7,1.27; 37 15.24,-1.27; 38 15.24,1.27; 39 17.78,-1.27; 40 17.78,1.27; 41 20.32,-1.27; 42 20.32,1.27; 43 22.86,-1.27; 44 22.86,1.27; 45 25.4,-1.27; 46 25.4,1.27; 47 27.94,-1.27; 48 27.94,1.27; 49 30.48,-1.27; 50 30.48,1.27
JP1 = drill 0.914 long: 1 0,-1.27; 2 0,1.27
SML0603 = smd 0.8 x 0.8: A 0.75,0; C -0.75,0
WS2812C2020 = smd 0.7 x 0.7: 1 0.915,-0.55; 2 0.915,0.55; 3 -0.915,0.55; 4 -0.915,-0.55
SOT95P237X112-3N = smd 1.3 x 0.6: 1 -1.05,0.95; 2 -1.05,-0.95; 3 1.05,0
R0603 = smd 1 x 1.1: 1 -0.85,0; 2 0.85,0
CTS742C083 = smd 0.5 x 0.9: 1 -1.2,-0.8; 2 -0.4,-0.8; 3 0.4,-0.8; 4 1.2,-0.8; 5 1.2,0.8; 6 0.4,0.8; 7 -0.4,0.8; 8 -1.2,0.8
SMRS-1 = smd 3 x 6 bottom: P$1 11.5,4.7; P$2 7,4.7 | smd 3 x 6: P$3 6.995,4.7; P$4 11.512,4.7
7395-04 = drill 1.016 long: 1 3.81,0; 2 1.27,0; 3 -1.27,0; 4 -3.81,0

### Placement (x,y rotation side)
C1  58,65.38 180 top
C2  86.55,23.97 90 top
C3  77.1,23.97 90 top
C4  11.73,21.69 90 top
C5  12.75,17.24 270 top
C6  11.01,17.25 270 top
C7  3.77,25.39 180 top
C8  8.07,25.42 0 top
C9  35.78,66.57 270 top
C10  40.3,74.19 90 top
C201  31.02,23.97 270 top
C202  49.66,23.77 180 top
C203  49.62,21.85 180 top
C204  39.51,23.97 270 top
C205  21.84,23.99 270 top
C206  59.16,27.54 90 top
C207  50.51,27.54 90 top
C208  20.03,15.64 180 top
C209  87.82,16.27 90 top
C210  20.07,17.22 180 top
C211  89.25,16.27 90 top
D1  25.89,55.9 180 top
IC1  56.36,49.69 90 top
IC2  81.63,23.97 270 top
IC3  72.42,23.97 270 top
IC4  5.46,20.18 180 top
IC5  58,69.82 180 top
IC6  37.05,70.14 180 top
IC201  35.35,23.97 90 top
IC202  26.7,23.97 90 top
IC203  43.84,23.97 90 top
IC204  54.64,18.26 90 top
J1  70.07,69.82 90 top
J2  25.61,73.67 180 top
J203  54.96,5.4 180 top
JP201  65.99,19.84 270 top
LED1  8.94,28.18 180 top
LED2  37.05,74.19 0 top
Q201  88.3,11.91 90 top
Q202  84.72,11.91 90 top
Q203  81.15,11.91 90 top
Q204  77.58,11.91 90 top
Q205  74.01,11.91 90 top
Q206  70.44,11.91 90 top
Q207  66.86,11.91 90 top
Q208  63.29,11.91 90 top
Q209  59.72,11.91 90 top
Q210  49.96,11.91 90 top
Q211  46.39,11.91 90 top
Q212  42.81,11.91 90 top
Q213  39.24,11.91 90 top
Q214  35.67,11.91 90 top
Q215  32.1,11.91 90 top
Q216  28.53,11.91 90 top
Q217  24.95,11.91 90 top
Q218  21.38,11.91 90 top
R1  65.31,65.69 270 top
R2  65.31,72.44 90 top
R3  29.51,65.64 0 top
R4  29.49,63.95 0 top
R5  11.61,28.17 0 top
R6  32.09,30.62 0 top
R7  38.68,33.96 0 top
R8  30.4,32.11 180 top
R202  60.2,21.43 270 top
R203  61.04,19.2 0 top
R204  86.39,15.32 90 top
R205  84.72,15.32 90 top
R206  81.15,15.32 90 top
R207  77.58,15.32 90 top
R208  74.01,15.32 90 top
R209  70.44,15.32 90 top
R210  66.86,15.32 90 top
R211  63.29,15.32 90 top
R212  59.72,15.32 90 top
R213  49.96,15.32 90 top
R214  46.39,15.32 90 top
R215  42.81,15.32 90 top
R216  39.24,15.32 90 top
R217  35.67,15.32 90 top
R218  32.1,15.32 90 top
R219  28.53,15.32 90 top
R220  24.95,15.32 90 top
R221  23.29,15.32 90 top
R222  53.61,12.62 180 top
R223  53.61,11.03 0 top
R224  56.55,11.03 180 top
R225  29.35,36.75 270 top
R250  41.89,70.38 0 top
R251  41.89,68.73 0 top
RN1  66.58,68.87 270 top
SW1  1.16,30.06 0 top
X10  13.4,64.54 180 top

### Tracks (layer width: path | path; a pad name or v marks a point on that pad's centre or on a via)
3V3(OUT)
  Top 0.254: IC1.36 IC1.P$36
5V  (via drill 0.5)
  Top 0.254: 58.71,25.64 C206.1 | C10.1 51.15,73.34 52.36,74.55 64.05,74.55 R2.2 66.95,73.29 v66.96,73.28 | v66.96,65.03 66.78,64.84 66.34,64.84 | 66.34,64.84 R1.2 | 66.34,64.84 67.75,63.44 75.61,63.44 76.73,62.33 v76.73,49.15
  Top 0.305: C9.1 35.78,68.91 35.77,68.91 35.77,69.49 IC6.5 34.56,69.49 33.31,70.74 v33.31,72.01 | LED2.4 36.16,73.61 36.16,72.33 | 36.16,72.33 36.48,72.01 39.98,72.01 40.29,72.33 40.29,73.33 C10.1 | v35.61,72.01 35.85,72.01 36.16,72.33
  Top 0.61: 8.15,30.58 8.15,28.21 LED1.A 7.22,27.22 C8.1 | 8.15,30.58 SW1.P$3 8.22,34.83 8.22,41.21 9.49,42.48 15.21,42.48 16.16,43.44 16.16,55.18 16.88,55.9 D1.A 23.78,55.95 23.78,60.9 25.45,62.56 31.64,62.56 33.94,64.87 33.94,67.25 34.11,67.42 C9.1 | C8.1 5.25,25.42 C7.1 | IC4.3 7.59,22.48 7.22,22.85 C8.1 | v7.99,31.21 8.15,30.58 | IC204.3 56.94,17.22 v58.71,18.99 | v58.71,24.38 58.71,25.64
  Bottom 0.254: v66.96,73.28 v66.96,65.03 | v76.73,49.15 76.73,45.02 79.19,42.56 79.19,37.24 86.01,30.42 86.01,28.51 85.69,28.2 63.47,28.2 61.25,25.97 61.25,24.7 60.93,24.38 v58.71,24.38
  Bottom 0.305: v33.31,72.01 v35.61,72.01
  Bottom 0.61: SW1.P$2 8.16,31.38 8.15,31.21 v7.99,31.21 | v58.71,18.99 v58.71,24.38
5V_IN  (via drill 0.5)
  Top 0.254: SW1.P$4 SW1.P$1 12.66,38.04 v12.67,38.2
  Top 0.61: J2.A9 24.09,68.53 | 24.09,68.53 24.1,68.52 26.64,68.52 27.13,69.01 J2.B9 | 24.09,68.53 24.08,68.52 9.81,68.52 9.59,68.3 X10.1 9.59,49.37 12.67,46.29 v12.67,44.7
  Bottom 0.254: v12.67,38.2 12.66,38.75
  Bottom 0.61: SW1.P$1 12.66,38.75 12.66,44.69 v12.67,44.7
AAAA
  Top 0.254: Q201.3 88.3,13.85 88.23,13.91 86.95,13.91 R204.1
ACK  (via drill 0.5)
  Top 0.254: IC203.17 IC203.4 42.87,16.23 R215.2 42.61,15.97 41.48,15.97 41.01,15.5 v41.01,14.78
  Bottom 0.254: J203.38 41.01,5.42 v41.01,14.78
ATN  (via drill 0.5)
  Top 0.254: v47.99,16.05 48.11,16.17 R213.2 | IC201.6 35.68,19.48 35.85,19.3 39.66,19.3 41.64,17.32 v41.8,17.32
  Bottom 0.254: J203.32 48.63,5.42 48.63,14.15 47.99,14.78 v47.99,16.05 43.07,16.05 v41.8,17.32
ATN_MSG  (via drill 0.5)
  Top 0.254: IC1.P$31 IC1.31 55.22,58.46 55.22,51.05 54.9,50.74 v52.67,50.74 | IC202.8 IC202.13 28.32,28.73 v28.23,28.83 | IC201.14 v36.33,28.67 v36.32,28.67 | R225.1 29.35,38.53 v29.5,38.67
  Bottom 0.254: v52.67,50.74 48.86,50.74 42.2,44.07 32.04,44.07 30.77,42.8 30.77,38.67 | 30.77,38.67 30.77,36.45 33.62,33.59 35.53,33.59 36.48,32.64 36.48,28.83 v36.32,28.67 35.85,29.15 28.55,29.15 v28.23,28.83 | v29.5,38.67 30.77,38.67
BSY  (via drill 0.5)
  Top 0.254: IC202.15 27.02,23.97 | 27.02,23.97 IC202.6 | v40.37,17.16 40.37,17.64 39.34,18.67 35.21,18.67 35.03,18.86 IC201.5 35.03,23.86 v34.97,23.91 | v45.05,14.94 45.05,15.81 45.37,16.13 46.34,16.13 R214.2 | 27.02,23.97 27.17,23.97 v27.27,23.99
  Bottom 0.254: J203.36 43.55,5.42 43.55,10.49 45.05,12 v45.05,14.94 42.67,14.94 40.45,17.16 v40.37,17.16 | v27.27,23.99 34.89,23.99 v34.97,23.91
C0  (via drill 0.5)
  Top 0.254: IC2.3 83.25,28.25 | 83.25,28.25 83.25,30.5 v83,30.75 | IC1.P$1 32.23,40.23 32.25,40.25 32.25,40.78 IC1.1 | IC2.2 83.9,28.1 83.75,28.25 83.25,28.25
  Bottom 0.254: IC1.1 32.25,40.78 32.25,36.5 33.25,35.5 50.75,35.5 55.52,30.73 68.87,30.73 68.88,30.75 v83,30.75
C1  (via drill 0.5)
  Top 0.254: IC2.5 81.95,28.25 | 81.95,28.25 81.95,31.55 v81.75,31.75 | IC1.P$2 IC1.2 | IC2.4 82.6,28.15 82.5,28.25 81.95,28.25
  Bottom 0.254: 34.75,40.78 IC1.2 34.77,36.48 35.25,36 51,36 55.63,31.37 81.37,31.37 v81.75,31.75
C2  (via drill 0.5)
  Top 0.254: IC2.7 80.65,28.25 | 80.65,28.25 80.65,32.84 v80.67,32.86 | IC2.6 81.3,27.95 81,28.25 80.65,28.25 | IC1.P$4 IC1.4
  Bottom 0.254: IC1.4 39.85,36.9 40.25,36.5 51.25,36.5 55.74,32.01 79.82,32.01 v80.67,32.86
C3  (via drill 0.5)
  Top 0.254: IC2.9 79.35,28.25 | 79.35,28.25 79.35,33.65 v79.25,33.75 | IC2.8 80,28 79.75,28.25 79.35,28.25 | IC1.P$5 IC1.5
  Bottom 0.254: IC1.5 42.39,37.61 43,37 51.5,37 55.86,32.64 78.14,32.64 v79.25,33.75
C4  (via drill 0.5)
  Top 0.254: IC3.3 74.05,28.25 | 74.05,28.25 74.05,35.2 73.25,36 58.5,36 v58.5,36.33 | IC3.2 74.69,28.05 74.5,28.25 74.05,28.25 | IC1.P$6 IC1.6
  Bottom 0.254: v58.5,36.33 58.5,34.25 58.25,34 55.25,34 51.75,37.5 45.5,37.5 44.93,38.07 IC1.6
C5  (via drill 0.5)
  Top 0.254: IC3.5 72.75,28.25 | 72.75,28.25 72.75,34.51 71.75,35.5 57.25,35.5 v57.25,36.25 | IC1.P$7 IC1.7 | IC3.4 73.4,28.1 73.25,28.25 72.75,28.25
  Bottom 0.254: v57.25,36.25 57.25,34.75 57,34.5 55.5,34.5 52,38 48.25,38 47.5,38.75 47.5,40.77 IC1.7
C6  (via drill 0.5)
  Top 0.254: IC3.7 71.44,28.25 | 71.44,28.25 71.44,34.55 71,35 56,35 v56,36.25 | IC1.P$9 IC1.9 | IC3.6 72.09,28.16 72,28.25 71.44,28.25
  Bottom 0.254: v56,36.25 55.75,36.5 54.75,36.5 52.55,38.7 IC1.9
C7
  Top 0.254: IC3.9 70.15,28.25 | 70.15,28.25 70.15,34.1 69.75,34.5 55.5,34.5 55.09,34.91 IC1.P$10 IC1.10 | IC3.8 70.8,28.2 70.75,28.25 70.15,28.25
C/D  (via drill 0.5)
  Top 0.254: IC202.16 IC202.5 26.38,16.39 v26.64,16.13 28.48,16.13 R219.2
  Bottom 0.254: J203.46 28.31,5.38 28.31,11.92 26.64,13.59 v26.64,16.13
CACK  (via drill 0.5)
  Top 0.254: IC1.14 IC1.P$14 65.25,43.5 64.25,44.5 49.75,44.5 48.77,43.52 48.77,33.92 48.5,33.66 44.45,33.66 v43.82,33.04 | v43.5,30.25 43.52,30.23 IC203.16 IC203.5
  Bottom 0.254: v43.5,30.25 43.5,32.73 v43.82,33.04
CKEYB_RX
  Top 0.305: RN1.1 65.25,70.07 65.22,70.11 | 65.22,70.11 65.22,71.5 R2.1 | IC5.3 62.83,68.2 63.15,68.52 63.15,69.79 63.47,70.11 65.22,70.11
CKEYB_TX  (via drill 0.5)
  Top 0.254: v59.02,67.88 57.44,69.47 57.12,69.47
  Top 0.305: RN1.3 64.15,68.47 v64.1,68.52 | 57.12,69.47 55.09,69.47 IC5.16
  Bottom 0.254: v64.1,68.52 59.66,68.52 v59.02,67.88
CKEYB_TX_ORIG
  Top 0.305: RN1.4 65.75,67.64 65.22,67.64 | 65.22,67.64 65.22,66.63 R1.1 | IC5.2 65.12,67.55 65.22,67.64
D0  (via drill 0.5)
  Top 0.254: R204.2 86.39,17.06 v86.41,17.16 86.41,17.96 86.01,18.35 84.11,18.35 83.25,19.21 | IC2.18 83.25,19.21 | IC2.17 82.6,19.54 82.84,19.3 83.16,19.3 83.25,19.21
  Bottom 0.254: J203.2 87.28,5.97 87.28,9.78 86.41,10.65 v86.41,17.16
D1  (via drill 0.5)
  Top 0.254: R205.2 84.72,17.14 v84.74,17.16 84.03,17.16 81.95,19.24 | IC2.16 81.95,19.24 | IC2.15 81.3,19.57 81.57,19.3 81.89,19.3 81.95,19.24
  Bottom 0.254: J203.4 84.19,5.42 84.19,10.26 84.74,10.81 v84.74,17.16
D2  (via drill 0.5)
  Top 0.254: R206.2 81.15,17.1 v81.09,17.16 80.65,17.6 80.65,19.3 | IC2.14 80.65,19.3 | IC2.13 80,19.44 80.14,19.3 80.65,19.3
  Bottom 0.254: J203.6 81.65,5.42 81.65,10.26 81.09,10.81 v81.09,17.16
D3  (via drill 0.5)
  Top 0.254: R207.2 77.58,17.14 v77.6,17.16 78.7,18.27 78.7,19.3 | IC2.11 78.7,19.3 | IC2.12 79.35,19.47 79.19,19.3 78.7,19.3
  Bottom 0.254: J203.8 79.11,5.42 79.11,9.78 77.6,11.29 v77.6,17.16
D4  (via drill 0.5)
  Top 0.254: R208.2 74.03,16.19 v74.03,17.16 74.03,19.38 | IC3.18 74.03,21.02 74.03,19.38 | IC3.17 73.4,19.54 73.55,19.38 74.03,19.38
  Bottom 0.254: J203.10 74.03,5.38 v74.03,17.16
D5  (via drill 0.5)
  Top 0.254: R209.2 70.45,16.19 v70.45,17.16 72.09,18.8 72.09,19.38 | IC3.15 72.09,19.38 | IC3.16 72.75,19.53 72.6,19.38 72.09,19.38
  Bottom 0.254: J203.12 71.49,5.38 71.49,8.75 70.45,9.78 v70.45,17.16
D6  (via drill 0.5)
  Top 0.254: R210.2 66.86,17.14 v66.88,17.16 68.95,17.16 70.8,19.01 70.8,19.38 | IC3.13 70.8,19.38 | IC3.14 71.44,19.5 71.33,19.38 70.8,19.38
  Bottom 0.254: J203.14 68.95,5.38 68.95,8.43 66.88,10.49 v66.88,17.16
D7  (via drill 0.5)
  Top 0.254: v63.31,17.16 63.29,17.22 | 63.29,17.22 R211.2 | 63.29,17.22 64.1,18.04 68.55,18.04 69.5,18.98 69.5,19.38 | 69.5,19.38 IC3.11 | IC3.12 70.15,19.47 70.06,19.38 69.5,19.38
  Bottom 0.254: J203.16 66.33,5.46 66.33,8.11 63.31,11.13 v63.31,17.16
DATA_DIR  (via drill 0.5)
  Top 0.254: IC3.1 75.34,29.75 | 75.34,29.75 75.34,34.91 73.75,36.5 59.75,36.5 v59.75,37 | IC1.P$34 IC1.34 | IC2.1 84.55,29.7 v84.5,29.75 | v76,29.75 75.34,29.75
  Bottom 0.254: v59.75,37 59.5,37 58.93,37.57 58.93,53.82 58.25,54.5 47.75,54.5 47.47,54.78 IC1.34 | v84.5,29.75 v76,29.75
DP  (via drill 0.5)
  Top 0.254: IC203.12 46.12,24.55 | 46.12,24.55 IC203.9 | v59.66,17.16 59.72,17.1 R212.2 | 46.12,24.55 46.27,24.7 v46.96,24.7
  Bottom 0.254: J203.18 63.87,5.38 63.87,7.4 63.07,8.19 60.61,8.19 59.66,9.14 v59.66,17.16 59.58,17.08 56.48,17.08 56.17,17.4 56.17,24.38 55.85,24.7 v46.96,24.7
GND  (via drill 0.5)
  Top 0.254: C203.2 48.81,21.89 C202.2 | IC3.19 74.69,24.5 75.02,24.82 C3.2 | C2.2 84.23,24.82 83.9,24.5 IC2.19 83.9,19.51 84.11,19.3 84.74,19.3 | IC202.7 27.68,19.39 27.59,19.3 27.59,18.67 | 27.59,18.67 27.91,18.35 29.81,18.35 30.45,18.99 30.45,19.62 29.62,20.45 IC202.10 29.62,23.12 C201.2 | C204.2 38.71,23.12 38.28,22.69 | 38.28,22.69 IC201.10 | IC201.7 36.33,22.56 36.48,22.72 | 37.44,22.72 37.12,22.72 36.98,22.74 IC201.8 | 37.44,22.72 38.17,22.72 38.28,22.69 | IC201.9 37.63,22.68 37.44,22.72 | 27.59,18.67 v27.27,18.67 | v19.18,18.67 19.18,17.26 C210.2 | C205.2 21.84,19.34 v21.88,19.3 | IC202.14 27.68,28.03 27.27,28.43 | IC5.19 53.33,67.55 | 53.33,67.55 53.31,67.56 | 53.33,67.55 52.91,67.33 v52.91,66.85 | IC203.7 44.82,19.54 45.05,19.3 | 45.05,19.3 v45.05,18.67 | IC203.10 46.77,19.43 46.64,19.3 45.05,19.3 | IC6.3 38.05,70.74 39.66,70.74 40.61,71.69 41.25,71.69 | IC203.14 44.82,28.67 v44.66,28.83
  Top 0.61: C8.2 9.01,25.34 11.72,25.34 11.73,25.33 C4.2 | C6.2 10.09,16.4 IC4.1
  Bottom 0.254: v27.27,18.67 21.88,18.67 | 21.88,18.67 v19.18,18.67 | v21.88,19.3 21.88,18.67
  other vias: 58.87,7.95 57.44,9.94 37.12,22.8 31.01,21.13 21.48,29.7 47.28,23.11 67.28,23.11 62.52,29.47 77.12,35.81 80.62,24.7 72.36,24.07 40.21,77.01 63.07,71.93 35.77,63.68 50.06,66.85 16.4,29.7 2.43,29.7 8.46,13.83 20.53,6.84 33.78,22.8 39.5,21.69 54.5,29.07 86.25,19.78 67.12,51.93 52.91,71.53 58.07,72.33 41.88,72.09 31.96,65.18 14.34,23.19 31.01,18.27 37.44,15.02 68.47,29.39 77.04,26.69 88.23,24.86 62.68,43.04 50.06,42.88 61.09,65.26
  pour Top (isolate 0.406, rank 2): -0.06,78.38 91.15,78.38 91.15,0.29 -0.06,0.04 -0.06,32.75 0,33.25
  pour Bottom (isolate 0.305): -0.06,78.38 91.15,78.38 91.15,0.29 -0.06,0.04 -0.06,33.25 0,33.25
I/O  (via drill 0.5)
  Top 0.254: IC202.19 IC202.2 24.43,19.63 23.31,18.51 v23.31,17.16 23.29,17.14 R221.2
  Bottom 0.254: J203.50 22.83,5.78 22.83,16.77 23.31,17.24 v23.31,17.16
IN_OE_CS
  Top 0.254: IC1.P$15 IC1.15 67.79,44.21 67,45 47,45 46.23,44.23 46.23,37.3 45.69,36.77 44.42,36.77 42.2,34.55 42.2,33 40.2,31 33.86,31 33.45,30.59 | IC201.19 33.08,30.21 33.45,30.59 | R6.2 32.94,30.47 33.45,30.59
KEYB_RX
  Top 0.254: IC1.P$20 IC1.20 80.49,46.42 79.34,47.56 51.64,47.56 48.71,50.5 48.71,68.36 49.2,68.85 IC5.17
KEYB_TX  (via drill 0.5)
  Top 0.254: IC1.P$29 IC1.29 | IC5.4 60.93,68.83 59.34,68.83 58.07,70.11 v58.07,70.42
  Bottom 0.254: v58.07,70.42 58.07,63.75 60.17,61.66 IC1.29
KEYB_TX_ORIG
  Top 0.254: IC1.32 IC1.P$32 52.55,65.15 51.41,66.3 51.41,67.88 51.72,68.2 IC5.18
MSG  (via drill 0.5)
  Top 0.254: IC202.12 IC202.9 v28.98,19.27 | v33.94,16.13 35.63,16.13 R217.2
  Bottom 0.254: J203.42 33.39,5.38 33.39,15.57 v33.94,16.13 32.83,17.24 29.5,17.24 28.98,17.76 v28.98,19.27
N$1  (via drill 0.5)
  Top 0.254: J2.B5 25.11,72.47 v25.13,72.49 | v25.37,64.07 25.49,63.95 R4.1
  Bottom 0.254: v25.13,72.49 25.13,64.31 v25.37,64.07
N$2  (via drill 0.5)
  Top 0.254: J2.A5 26.11,71.96 v26.64,72.49 | v26.64,65.66 28.64,65.66 R3.1
  Bottom 0.254: v26.64,72.49 v26.64,65.66
N$3
  Top 0.305: IC6.2 40.8,70.14 R250.1
N$4
  Top 0.305: IC6.1 39.32,69.49 39.98,68.83 40.94,68.83 R251.1
N$5
  Top 0.254: R223.2 R224.2
N$6
  Top 0.61: LED1.C R5.1
N$7
  Top 0.305: IC6.4 35.16,70.79 34.58,71.38 34.58,74.55 34.77,74.74 LED2.3
N$8
  Top 0.254: R203.2 61.99,19.3 64.42,19.3 64.72,19.6 JP201.1
N$12
  Top 0.254: Q202.3 R205.1
N$13
  Top 0.254: Q203.3 R206.1
N$14
  Top 0.254: Q204.3 R207.1
N$15
  Top 0.254: Q205.3 R208.1
N$18
  Top 0.254: Q206.3 R209.1
N$19
  Top 0.254: Q207.3 R210.1
N$20
  Top 0.254: Q208.3 R211.1
N$21
  Top 0.305: RN1.6 69.98,68.47 J1.2
N$22
  Top 0.254: Q209.3 R212.1
N$24
  Top 0.254: Q210.3 R213.1
N$26
  Top 0.254: IC1.39 IC1.P$39
  Top 0.61: D1.C 34.02,55.9 34.77,56.65 IC1.39
N$30
  Top 0.254: IC204.1 52.34,13.61 52.67,13.27 52.67,12.7 R222.2 R223.1
N$100
  Top 0.254: Q211.3 R214.1
N$101
  Top 0.254: Q212.3 R215.1
N$102
  Top 0.254: Q213.3 R216.1
N$103
  Top 0.254: Q214.3 R217.1
N$104
  Top 0.254: Q215.3 R218.1
N$105
  Top 0.254: Q216.3 R219.1
N$106
  Top 0.254: Q217.3 R220.1
N$107
  Top 0.254: Q218.3 21.38,13.73 22.12,14.47 R221.1
OUT_LE1_DRQ  (via drill 0.5)
  Top 0.254: IC1.P$17 IC1.17 | IC202.11 29.66,26.94 29.66,29.39 29.55,29.49 R8.2 28.12,32.11 v27.91,32.32 | R250.2 45.1,70.38 46.25,69.23 46.25,49.47 | 46.25,49.47 46.25,48.59 47.91,46.93 72.36,46.93 72.68,46.61 v72.68,45.74 | v46.01,49.47 46.25,49.47
  Bottom 0.254: v72.68,45.74 72.68,41 IC1.17 | v27.91,32.32 27.91,41.85 30.77,44.7 41.25,44.7 v46.01,49.47
OUT_LE2_RESET  (via drill 0.5)
  Top 0.254: IC1.19 IC1.P$19 77.95,42.61 77.76,42.8 73.63,42.8 70.45,45.98 47.59,45.98 43.71,49.86 43.71,67.77 R251.2 | IC203.11 46.77,28.32 48.86,30.42 67.28,30.42 67.6,30.73 67.6,33.67 v67.84,33.59
  Bottom 0.254: v67.84,33.59 76.49,33.59 77.76,34.86 77.95,34.99 IC1.19
OUT_OE_INT  (via drill 0.5)
  Top 0.254: IC1.P$16 IC1.16 70.33,44.92 69.75,45.5 45.75,45.5 43.63,43.38 43.63,36.76 41,34.13 v41,33.91 40.95,33.96 R7.2 | v40.73,23.75 41,23.75 41,21.11 IC203.1 | IC202.1 23.78,21.04 23.78,24.7 v23.39,24.7
  Bottom 0.254: v41,33.91 41,24.94 | 41,24.94 41,23.75 v40.73,23.75 | v23.39,24.7 23.39,24.86 40.92,24.86 41,24.94
REQ  (via drill 0.5)
  Top 0.254: IC203.19 IC203.2 41.57,19 v41.56,19.15 | v24.97,17.16 24.95,17.14 R220.2
  Bottom 0.254: J203.48 25.77,5.38 25.77,14.38 24.97,15.18 v24.97,17.16 25.53,17.72 27.91,17.72 28.23,18.04 28.23,18.83 27.91,19.15 27.91,19.62 28.55,20.26 29.5,20.26 30.45,19.3 41.56,19.3 v41.56,19.15
RST  (via drill 0.5)
  Top 0.254: R216.2 39.24,17.22 v39.26,17.16 39.26,17.48 38.7,18.04 34.89,18.04 33.73,19.2 IC201.3
  Bottom 0.254: J203.40 35.93,5.38 35.93,8.03 39.26,11.37 v39.26,17.16
RST_C/D_REQ  (via drill 0.5)
  Top 0.254: IC1.12 IC1.P$12 60.17,43.08 59.25,44 52.25,44 51.31,43.06 51.31,34.1 50.33,33.12 45.69,33.12 44.66,32.08 43.58,32.08 42.25,30.75 42.25,28.51 | 42.25,28.51 42.25,26.94 IC203.18 IC203.3 | IC202.4 IC202.17 25.73,28.48 v26.16,28.83 | v34.58,28.35 34.38,28.15 IC201.17 | v39.34,28.51 42.25,28.51
  Bottom 0.254: v26.16,28.83 25.69,28.51 25.69,25.66 34.58,25.66 | 34.58,25.66 v34.58,28.35 | 34.58,25.66 38.39,25.66 39.34,26.61 v39.34,28.51
SEL  (via drill 0.5)
  Top 0.254: IC201.2 33.08,17.15 R218.2 32.06,16.13 v30.85,16.13
  Bottom 0.254: J203.44 30.85,5.38 v30.85,16.13
SEL_I/O_DP_A1  (via drill 0.5)
  Top 0.254: IC1.11 IC1.P$11 57.63,43.37 57.5,43.5 54.25,43.5 53.85,43.1 53.85,35.54 50.79,32.48 46.33,32.48 45.93,32.08 | IC202.3 IC202.18 25.07,29.84 v25.05,29.86 | IC203.8 IC203.13 45.5,26.94 45.5,31.66 45.93,32.08 | IC201.18 33.73,29.25 34.34,29.86 v34.74,30.18 40.13,30.18 42.83,32.96 42.83,33.91 43.47,34.55 v46.33,34.55 | v46.33,31.93 46.09,31.93 45.93,32.08
  Bottom 0.254: v25.05,29.86 34.26,29.94 34.5,30.18 v34.74,30.18 | v46.33,34.55 v46.33,31.93
TP_ON  (via drill 0.5)
  Top 0.254: Q218.1 20.43,9.32 20.61,9.14 24,9.14 | 24,9.14 27.58,9.14 | 27.58,9.14 31.15,9.14 | 31.15,9.14 34.72,9.14 | 34.72,9.14 38.29,9.14 | 38.29,9.14 41.86,9.14 | 41.86,9.14 45.44,9.14 | 45.44,9.14 49.01,9.14 | 49.01,9.14 58.71,9.14 | 58.71,9.14 v61.56,9.14 62.36,9.14 | 62.36,9.14 66.01,9.14 | 66.01,9.14 69.5,9.14 | 69.5,9.14 73,9.14 | 73,9.14 76.81,9.14 | 76.81,9.14 80.3,9.14 | 80.3,9.14 83.79,9.14 | 83.79,9.14 86.97,9.14 87.34,9.52 Q201.1 | Q202.1 83.79,10.84 83.79,9.14 | Q203.1 80.2,9.24 80.3,9.14 | Q204.1 76.63,9.32 76.81,9.14 | Q205.1 73.06,9.21 73,9.14 | Q206.1 69.49,9.16 69.5,9.14 | Q207.1 65.91,9.24 66.01,9.14 | Q208.1 62.34,9.32 62.36,9.14 | Q209.1 58.77,9.21 58.71,9.14 | Q210.1 49.01,9.14 | Q211.1 45.44,9.14 | Q212.1 41.86,9.14 | Q213.1 38.29,9.14 | Q214.1 34.72,9.14 | Q215.1 31.15,9.14 | Q216.1 27.58,9.14 | Q217.1 24,9.14 | R202.2 R203.1 60.19,18.46 61.56,17.08 v61.56,13.91
  Bottom 0.254: v61.56,13.91 v61.56,9.14
VBUS
  Top 0.254: IC1.40 IC1.P$40
VCC  (via drill 0.5)
  Top 0.254: 32.43,24.82 IC201.20 32.43,28.44 31.24,29.63 R6.1 R8.1 37.22,32.11 37.83,32.71 R7.1 | 32.43,24.82 IC201.1 | C201.1 32.43,24.82 | IC5.20 57.12,66.9 | 57.12,66.9 IC5.1 | C1.2 57.15,66.86 57.12,66.9
  Top 0.61: C4.1 11.67,20.18 IC4.2 | C4.1 11.01,19.53 C6.1 12.68,18.1 C5.1 | C4.1 18.05,20.24 18.7,20.89 18.7,32.96 19.97,34.23 20.29,34.23 | 20.29,34.23 30.77,34.23 31.25,33.75 R8.1 | 20.29,34.23 v20.29,52.33 | v55.22,65.03 55.57,65.38 C1.2
  Bottom 0.61: v20.29,52.33 20.29,60.26 21.24,61.22 53.63,61.22 55.22,62.8 v55.22,65.03
  pour Top (isolate 0.406): 0.69,16.38 0.69,25.27 7.76,25.34 7.76,16.45
VCCIO  (via drill 0.5)
  Top 0.254: Q218.2 22.33,11.66 22.59,11.92 | 22.59,11.92 25.9,11.92 | 25.9,11.92 29.48,11.92 | 29.48,11.92 33.05,11.92 | 33.05,11.92 36.62,11.92 | 36.62,11.92 40.19,11.92 | 40.19,11.92 43.76,11.92 | 43.76,11.92 47.34,11.92 | 47.34,11.92 50.53,11.92 50.91,11.55 | 50.91,11.55 Q210.2 | Q209.2 60.67,11.66 | 60.67,11.66 60.93,11.92 64.24,11.92 | 64.24,11.92 67.81,11.92 | 67.81,11.92 71.39,11.92 | 71.39,11.92 74.96,11.92 | 74.96,11.92 78.53,11.92 | 78.53,11.92 82.1,11.92 | 82.1,11.92 85.69,11.92 | 85.69,11.92 89.11,11.92 89.25,11.79 | 89.25,11.79 Q201.2 | Q202.2 85.69,10.86 85.69,11.92 | Q203.2 82.1,11.92 | Q204.2 78.53,11.92 | Q205.2 74.96,11.92 | Q206.2 71.39,11.92 | Q207.2 67.81,11.92 | Q208.2 64.24,11.92 | Q211.2 47.34,11.92 | Q212.2 43.76,11.92 | Q213.2 40.19,11.92 | Q214.2 36.62,11.92 | Q215.2 33.05,11.92 | Q216.2 29.48,11.92 | Q217.2 25.9,11.92 | IC204.2 54.64,12.8 R222.1 56.47,12.62 v56.48,12.64 58.55,12.64 59.52,11.66 60.67,11.66 | C203.1 50.47,23.74 C202.1 C207.1 | C203.1 54.14,21.85 IC204.4 55.56,22.28 R202.1 | 50.91,11.55 51.41,12.05 v51.41,12.64 | IC3.20 75.34,21.97 76.5,23.12 C3.1 v82.84,23.11 | IC2.20 84.55,22.29 85.39,23.12 C2.1 87.59,23.12 v87.6,23.11 87.6,19.62 88.23,18.99 90.14,18.99 90.38,18.75 90.38,15.57 90.31,15.42 C211.1 | C209.1 C211.1 | C211.1 89.5,15.17 89.5,12.05 89.25,11.79 | IC202.20 23.13,26.91 21.84,25.62 C205.1 21.66,25.02 20.93,25.02 20.61,24.7 20.61,21.84 20.92,21.54 C210.1 20.92,15.67 C208.1 20.88,14.82 20.37,14.3 20.37,12.24 20.69,11.92 22.59,11.92 | IC203.20 40.93,25.34 40.41,24.82 C204.1 38.74,24.82 v37.99,24.07 | v50.45,20.26 50.45,21.83 C203.1
  Top 0.61: IC204.2 IC204.4
  Bottom 0.254: v51.41,12.64 v56.48,12.64 | v82.84,23.11 v87.6,23.11 | v37.99,24.07 37.99,20.97 38.39,20.57 42.52,20.57 43.15,19.94 50.13,19.94 v50.45,20.26
  pour Top (isolate 0.406): 48.92,16.99 58.13,16.99 58.13,27.78 48.92,27.78
ZKEYB_RX
  Top 0.305: RN1.8 67.56,70.07 68.55,71.06 70.03,71.06 J1.3
ZKEYB_TX_ORIG
  Top 0.305: RN1.5 67.81,67.67 69.47,66.01 J1.1

### Text on the board
tNames: Cosmo2ex SCSI 4.05 | GND | IKBD | RX | TX | TX_ORIG | JUMPER | TRMPWR | PRESENT | ON | REMOVED | OFF | TERMPWR
bNames: GND | RX | TX | IKBD | TX_ORIG | TERMPWR